# Altium project MMT.PrjPcb (part 1 of 2)
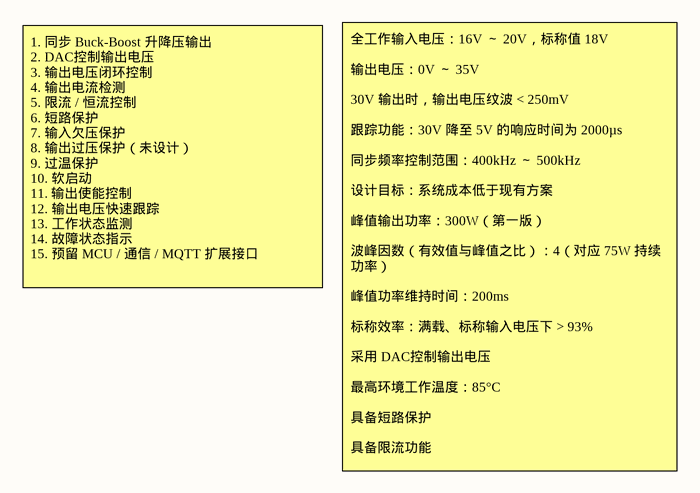
[diagram p0: main.SchDoc]
7 sheets, 325 parts. Net scope: global (net labels, ports and power ports of the same name join across sheets).
Board file: 数控电源.PcbDoc
Sheets:
  main.SchDoc
  SMPS_POWER.SchDoc
  Bias_Power_Supply.SchDoc
  CC_CV_Down-programmer.SchDoc
  CC_CV_Indicators_and_sense_error.SchDoc
  DAC、ADC、IO_Espander.SchDoc
  Bus isolators.SchDoc

## Sheet main.SchDoc
size A4; SheetNumber: 1; SheetTotal: 7

### Notes on the sheet
- 1. 同步 Buck-Boost 升降压输出
  2. DAC控制输出电压
  3. 输出电压闭环控制
  4. 输出电流检测
  5. 限流 / 恒流控制
  6. 短路保护
  7. 输入欠压保护
  8. 输出过压保护（未设计）
  9. 过温保护
  10. 软启动
  11. 输出使能控制
  12. 输出电压快速跟踪
  13. 工作状态监测
  14. 故障状态指示
  15. 预留 MCU / 通信 / MQTT 扩展接口
- 全工作输入电压：16V ～ 20V，标称值 18V
  输出电压：0V ～ 35V
  30V 输出时，输出电压纹波 < 250mV
  跟踪功能：30V 降至 5V 的响应时间为 2000µs
  同步频率控制范围：400kHz ～ 500kHz
  设计目标：系统成本低于现有方案
  峰值输出功率：300W（第一版）
  波峰因数（有效值与峰值之比）：4（对应 75W 持续功率）
  峰值功率维持时间：200ms
  标称效率：满载、标称输入电压下 > 93%
  采用 DAC控制输出电压
  最高环境工作温度：85°C
  具备短路保护
  具备限流功能

## Sheet SMPS_POWER.SchDoc
size A3; SheetNumber: 2; SheetTotal: 7
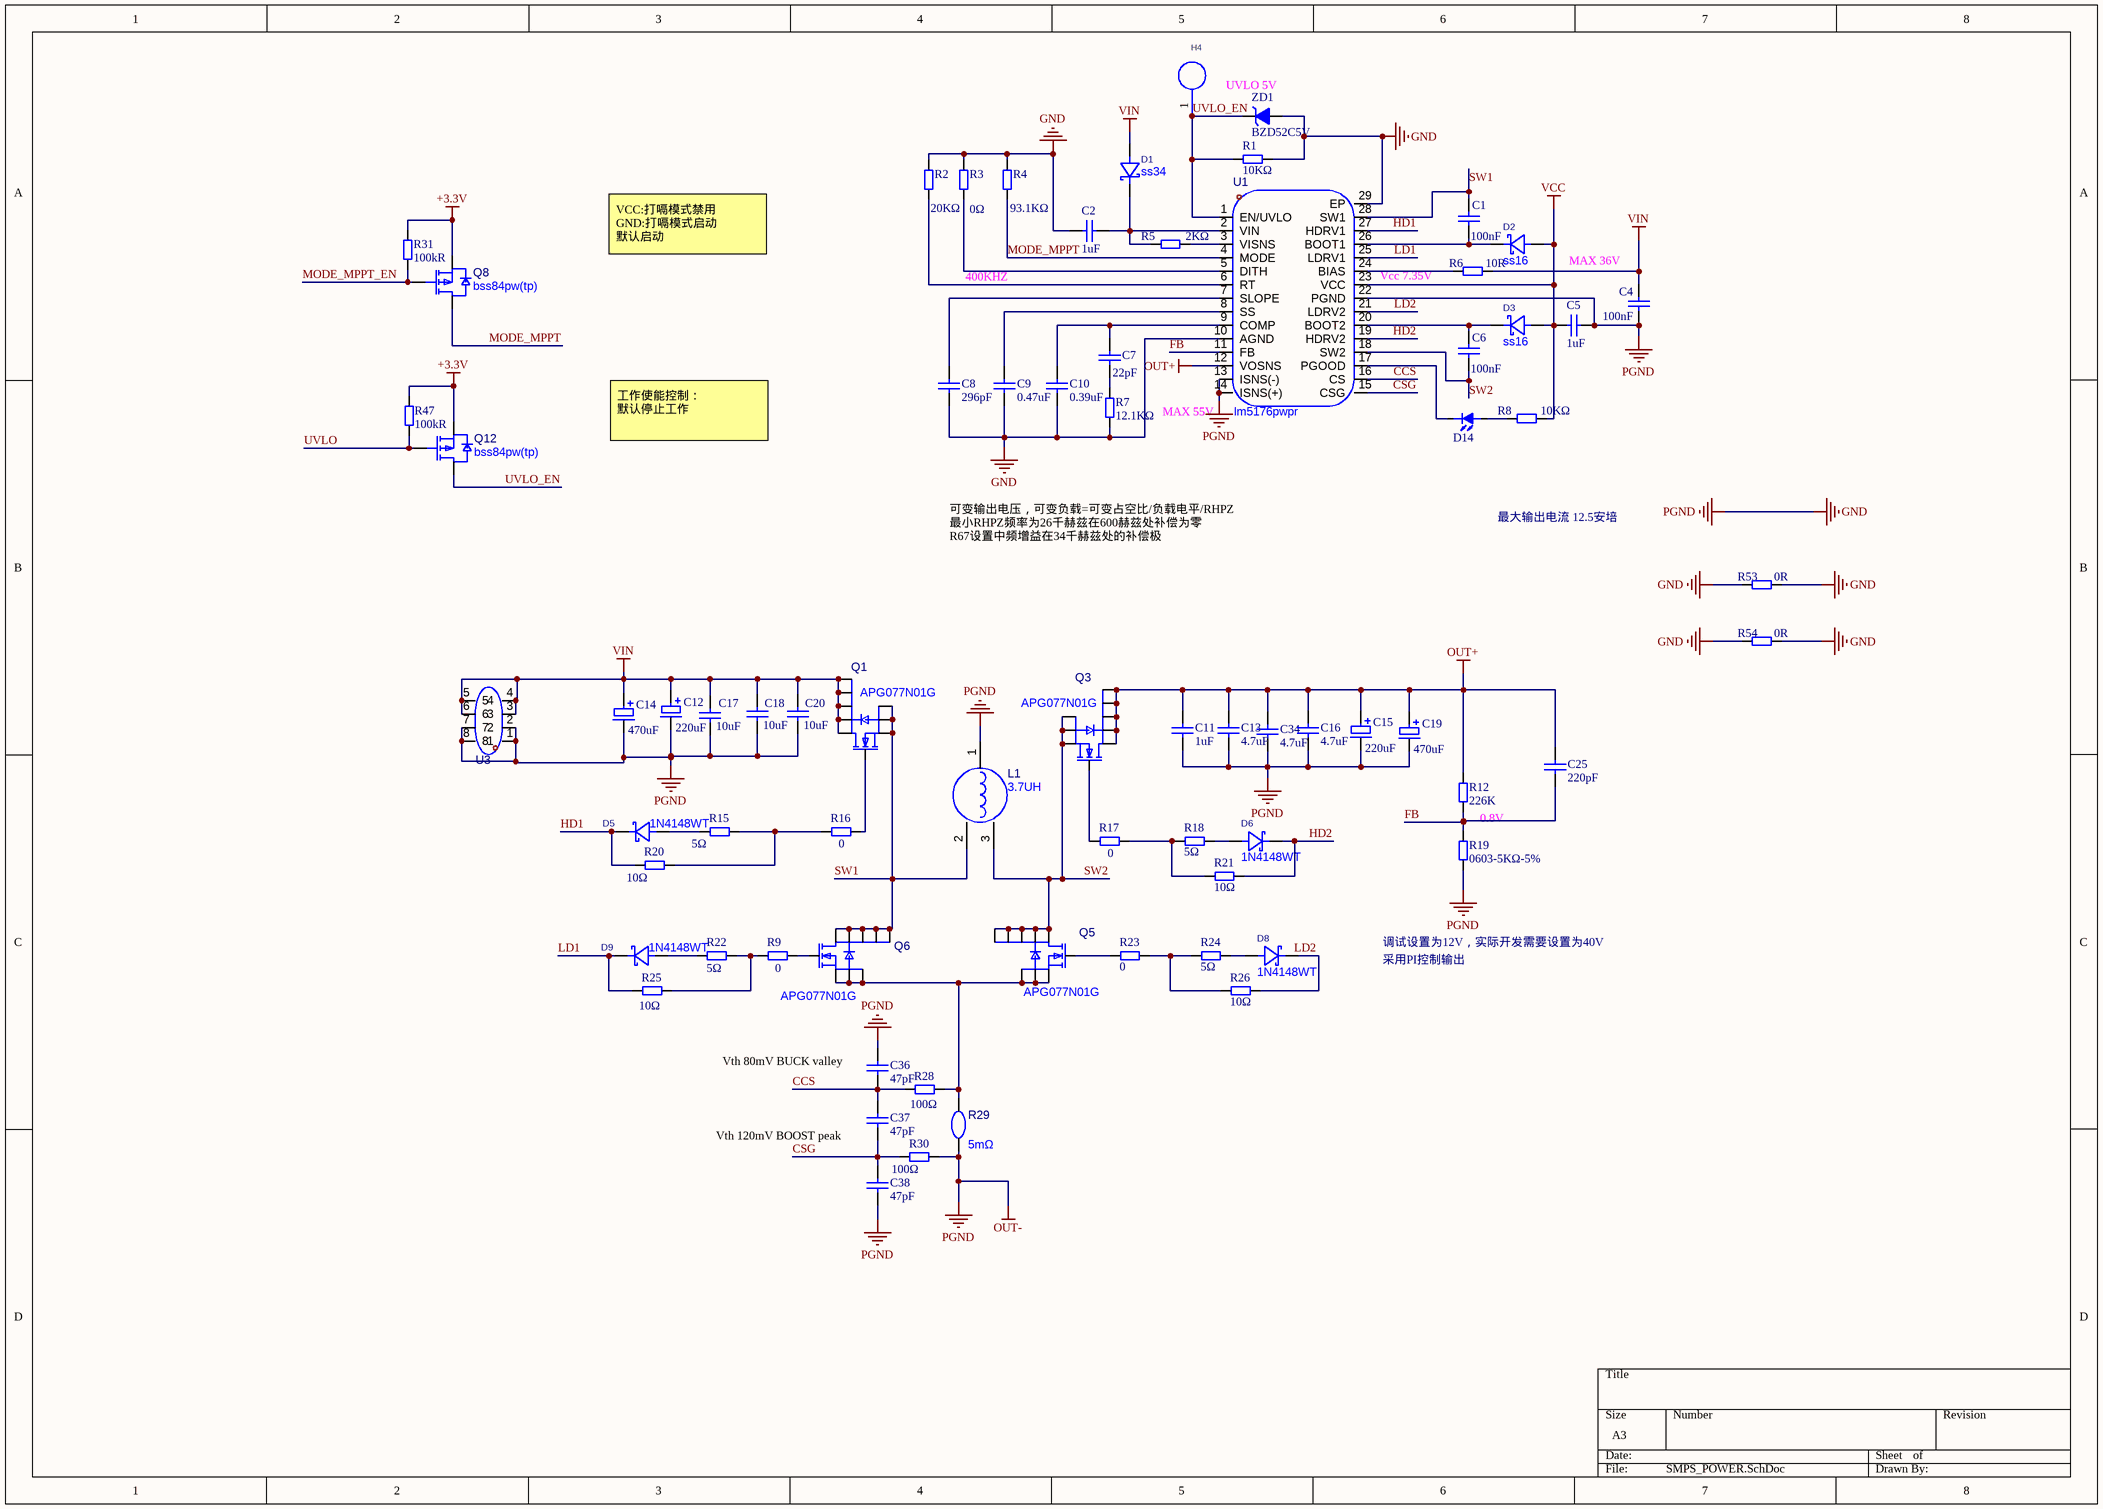
[diagram p1: SMPS_POWER.SchDoc]

### Parts
C1  100nF  [C0603]
C2  1uF  [C0603]
C4  100nF  [C0603]
C5  1uF  [C0603]
C6  100nF  [C0603]
C7  22pF  [C0603]
C8  296pF  [C0603]
C9  0.47uF  [C0603]
C10  0.39uF  [C0603]
C11  1uF  [C0805]
C12  220uF  [CAP-TH_BD8.0-P3.50-D0.5-FD]
C13  4.7uF  [C0805]
C14  470uF  [CAP-TH_BD8.0-P3.50-D0.5-FD]
C15  220uF  [CAP-TH_BD8.0-P3.50-D0.5-FD]
C16  4.7uF  [C0805]
C17  10uF  [C0805]
C18  10uF  [C0805]
C19  470uF  [CAP-TH_BD8.0-P3.50-D0.5-FD]
C20  10uF  [C0805]
C25  220pF  [C0603]
C34  4.7uF  [C0805]
C36  47pF  [C0603]
C37  47pF  [C0603]
C38  47pF  [C0603]
D1  ss34  [SMA_L4.3-W2.6-LS5.0-FD]
D2  ss16  [SMA_L4.3-W2.6-LS5.0-FD]
D3  ss16  [SMA_L4.3-W2.6-LS5.0-FD]
D5  1N4148WT  [SOD-523_L1.2-W0.8-LS1.6-FD]
D6  1N4148WT  [SOD-523_L1.2-W0.8-LS1.6-FD]
D8  1N4148WT  [SOD-523_L1.2-W0.8-LS1.6-FD]
D9  1N4148WT  [SOD-523_L1.2-W0.8-LS1.6-FD]
D14  DIO_LED  [LED0603-RD_RED]  (value not drawn)
H4  PZ254V-11-01P  [HDR-TH_1P-P2.54-V-M]  (value not drawn)
L1  3.7UH  [IND-SMD_3P-L15.5-W15.5-L]
Q1  APG077N01G  [PDFN-8_L5.8-W5.1-P1.27-LS6.1-BL]
Q3  APG077N01G  [PDFN-8_L5.8-W5.1-P1.27-LS6.1-BL]
Q5  APG077N01G  [PDFN-8_L5.8-W5.1-P1.27-LS6.1-BL]
Q6  APG077N01G  [PDFN-8_L5.8-W5.1-P1.27-LS6.1-BL]
Q8  bss84pw(tp)  [SOT-323-3_L2.0-W1.3-P1.30-LS2.1-BR]
Q12  bss84pw(tp)  [SOT-323-3_L2.0-W1.3-P1.30-LS2.1-BR]
R1  10KΩ  [R0603]
R2  20KΩ  [R0603]
R3  0Ω  [R0603]
R4  93.1KΩ  [R0603]
R5  2KΩ  [R0603]
R6  10R  [R0603]
R7  12.1KΩ  [R0603]
R8  10KΩ  [R0603]
R9  0  [R0603]
R12  226K  [R0603]
R15  5Ω  [R0603]
R16  0  [R0603]
R17  0  [R0603]
R18  5Ω  [R0603]
R19  0603-5KΩ-5%  [R0603]
R20  10Ω  [R0603]
R21  10Ω  [R0603]
R22  5Ω  [R0603]
R23  0  [R0603]
R24  5Ω  [R0603]
R25  10Ω  [R0603]
R26  10Ω  [R0603]
R28  100Ω  [R0603]
R29  5mΩ  [RES-SMD_L6.4-W3.2-1]
R30  100Ω  [R0603]
R31  100kR  [R0603]
R47  100kR  [R0603]
R53  0R  [R0603]
R54  0R  [R0603]
U1  lm5176pwpr  [HTSSOP-28_L9.7-W4.4-P0.65-LS6.4-BL-EP]
U3  c4201wr-2x4p_c5333418  [CONN-TH_8P-P4.20_CJT_C4201WR-2X4P]  (value not drawn)
ZD1  BZD52C5V  [SOD-123_L2.7-W1.6-LS3.7-RD]

### Nets
+3.3V: Q8.2(S) Q12.2(S) R31.1 R47.1
GND: C2.1 C4.1 C5.1 C8.1 C9.1 C10.1 C11.1 C12.2 C13.1 C14.2 C15.2 C16.1 C17.1 C18.1 C19.2 C20.1 C34.1 C36.2 C38.1 L1.1 R1.2 R2.2 R3.2 R4.2 R7.1 R19.1 R29.1 R30.1 R53.1 R53.2 R54.1 R54.2 U1.10(AGND) U1.13(ISNS(-)) U1.14(ISNS(+)) U1.22(PGND) U1.29(EP) U3.1 U3.2 U3.7 U3.8 ZD1.2  [also labelled OUT-, PGND]
OUT+: C11.2 C13.2 C15.1 C16.2 C19.1 C25.2 C34.2 Q3.5(D) Q3.6(D) Q3.7(D) Q3.8(D) Q3.9(D) R12.2 U1.12(VOSNS)  [project net SENSE+]
VCC: C5.2 D2.1(A) D3.1(A) R8.2 U1.23(VCC)
VIN: C4.2 C12.1 C14.1 C17.2 C18.2 C20.2 D1.1(A) Q1.5(D) Q1.6(D) Q1.7(D) Q1.8(D) Q1.9(D) R6.2 U3.3 U3.4 U3.5 U3.6
CCS: C36.1 C37.2 R28.2 U1.16(CS)
CSG: C37.1 C38.2 R30.2 U1.15(CSG)
FB: C25.1 R12.1 R19.2 U1.11(FB)
HD1: D5.2(K) R20.2 U1.27(HDRV1)
HD2: D6.2(K) R21.2 U1.19(HDRV2)
LD1: D9.2(K) R25.2 U1.25(LDRV1)
LD2: D8.2(K) R26.2 U1.21(LDRV2)
MODE_MPPT: Q8.3(D) R4.1 U1.4(MODE)
MODE_MPPT_EN: Q8.1(G) R31.2
SW1: C1.2 L1.2 Q1.1(S) Q1.2(S) Q1.3(S) Q6.5(D) Q6.6(D) Q6.7(D) Q6.8(D) Q6.9(D) U1.28(SW1)
SW2: C6.1 L1.3 Q3.1(S) Q3.2(S) Q3.3(S) Q5.5(D) Q5.6(D) Q5.7(D) Q5.8(D) Q5.9(D) U1.18(SW2)
UVLO: Q12.1(G) R47.2
UVLO_EN: H4.1 Q12.3(D) R1.1 U1.1(EN/UVLO) ZD1.1
NetC1_1: C1.1 D2.2(K) U1.26(BOOT1)
NetC2_2: C2.2 D1.2(K) R5.1 U1.2(VIN)
NetC6_2: C6.2 D3.2(K) U1.20(BOOT2)
NetC7_1: C7.1 R7.2
NetC7_2: C7.2 C10.2 U1.9(COMP)
NetC8_2: C8.2 U1.7(SLOPE)
NetC9_2: C9.2 U1.8(SS)
NetD5_1: D5.1(A) R15.2
NetD6_1: D6.1(A) R18.2
NetD8_1: D8.1(A) R24.2
NetD9_1: D9.1(A) R22.2
NetD14_1: D14.1 U1.17(PGOOD)
NetD14_2: D14.2 R8.1
NetQ1_4: Q1.4(G) R16.1
NetQ3_4: Q3.4(G) R17.2
NetQ5_1: Q5.1(S) Q5.2(S) Q5.3(S) Q6.1(S) Q6.2(S) Q6.3(S) R28.1 R29.2
NetQ5_4: Q5.4(G) R23.2
NetQ6_4: Q6.4(G) R9.1
NetR2_1: R2.1 U1.6(RT)
NetR3_1: R3.1 U1.5(DITH)
NetR5_2: R5.2 U1.3(VISNS)
NetR6_1: R6.1 U1.24(BIAS)
NetR9_2: R9.2 R22.1 R25.1
NetR15_1: R15.1 R16.2 R20.1
NetR17_1: R17.1 R18.1 R21.1
NetR23_1: R23.1 R24.1 R26.1

### Notes on the sheet
- UVLO 5V
- VCC:打嗝模式禁用
  GND:打嗝模式启动
  默认启动
- 400KHZ
- Vcc 7.35V
- MAX 36V
- 工作使能控制：
  默认停止工作
- (near U1) MAX 55V
- 最大输出电流 12.5安培
- 可变输出电压，可变负载=可变占空比/负载电平/RHPZ
  最小RHPZ频率为26千赫兹在600赫兹处补偿为零
  R67设置中频增益在34千赫兹处的补偿极
- 0.8V
- 调试设置为12V，实际开发需要设置为40V
- 采用PI控制输出
- (near C36) Vth 80mV BUCK valley
- Vth 120mV BOOST peak

### Library data of the parts
C1 C2 C4-C10 C25 C36-C38 = C0603: Capacitor; Value: 104; Published: 8-Jun-2000; LatestRevisionDate: 17-Jul-2002; LatestRevisionNote: Re-released for DXP Platform.; Publisher: Altium Limited
C11 C13 C16-C18 C20 C34 = C0805: Capacitor; Value: 104; Published: 8-Jun-2000; LatestRevisionDate: 17-Jul-2002; LatestRevisionNote: Re-released for DXP Platform.; Publisher: Altium Limited
C12 C14 C15 C19 = CAP_EC_1: 贴片铝电解电容（RVT1V101M0607）; Part Number: *; Brand: *
D1 = ss34_c7420365: 二极管配置:独立式;正向压降(Vf):550mV@3A;直流反向耐压(Vr):40V;整流电流:3A;; Manufacturer: R+O(宏嘉诚); AddInBom: yes; ModelId: 7e24bebe6cd74171ae8c9de6fc5b78aa; ModelTransform: 198.4248,103.5431,0,180,0,0,-0.001,0,0; Diode Configuration: 独立式; Voltage - DC Reverse(Vr): 40V; Current - Rectified: 3A; Reverse Leakage Current (Ir): 200uA@40V; Symbol: SS34_C7420365; LCSC Part Name: 电压:40V 电流:3A; SupplierPart: C7420365; ManufacturerPart: SS34; Supplier Footprint: SMA(DO-214AC); JLCPCB Part Class: Extended Part; Datasheet: https://item.szlcsc.com/datasheet/SS34/8397187.html; Supplier: LCSC; ConvertToPcb: yes; FootprintName: SMA_L4.3-W2.6-LS5.0-FD; ModelName: SMA_L4.3-W2.6-LS5.0-FD; Voltage - Forward(Vf@If): 550mV@3A
D2 D3 = ss34_c7420365: 二极管配置:独立式;正向压降(Vf):550mV@3A;直流反向耐压(Vr):40V;整流电流:3A;; Manufacturer: R+O(宏嘉诚); ManufacturerPart: SS34; AddInBom: yes; ModelId: 7e24bebe6cd74171ae8c9de6fc5b78aa; ModelTransform: 198.4248,103.5431,0,180,0,0,-0.001,0,0; Diode Configuration: 独立式; Voltage - DC Reverse(Vr): 40V; Current - Rectified: 3A; Reverse Leakage Current (Ir): 200uA@40V; Symbol: SS34_C7420365; LCSC Part Name: 电压:40V 电流:3A; SupplierPart: C7420365; Supplier Footprint: SMA(DO-214AC); JLCPCB Part Class: Extended Part; Datasheet: https://item.szlcsc.com/datasheet/SS34/8397187.html; Supplier: LCSC; ConvertToPcb: yes; FootprintName: SMA_L4.3-W2.6-LS5.0-FD; ModelName: SMA_L4.3-W2.6-LS5.0-FD; Voltage - Forward(Vf@If): 550mV@3A
D5 D6 D8 D9 = 1N4148WT: 二极管配置:独立式;整流电流:150mA;直流反向耐压(Vr):100V;正向压降(Vf):1.25V@150mA;反向恢复时间(Trr):4ns;; Manufacturer: R+O(宏嘉诚); Symbol: 1N4148WT_C7420320; AddInBom: yes; ModelId: 8f56a03db567494d8f4c9d12aa52a741; ModelName: SOD-523_L1.2-W0.8-H0.7-LS1.6; ModelTransform: 62.992,31.496,0,0,0,0,0,0,0; Diode Configuration: 独立式; Pd - Power Dissipation: 150mW; Current - Rectified: 150mA; Voltage - DC Reverse(Vr): 100V; Non-Repetitive Peak Forward Surge Current: 2A; Reverse Leakage Current (Ir): 1uA@75V; Reverse Recovery Time (trr): 4ns; Operating Junction Temperature Range: -55℃~+150℃; LCSC Part Name: 100V 150mA; SupplierPart: C7420320; ManufacturerPart: 1N4148WT; Supplier Footprint: SOD-523; JLCPCB Part Class: Extended Part; Datasheet: https://item.szlcsc.com/datasheet/1N4148WT/8397142.html; Supplier: LCSC; ConvertToPcb: yes; FootprintName: SOD-523_L1.2-W0.8-LS1.6-FD; Voltage - Forward(Vf@If): 1.25V@150mA
D14 = DIO_LED: Brand: LED; Part Number: *
H4 = PZ254V-11-01P: Manufacturer: XFCN(兴飞); Add into BOM: yes; Pin Structure: 1x1P; Pitch: 2.54mm; Circluar Pins/Square Pins: 方针; Symbol: PZ254V-11-01P; Device: PZ254V-11-01P; LCSC Part Name: 1x1P 间距:2.54mm 方针 直插; Supplier Part: C492400; Manufacturer Part: PZ254V-11-01P; Supplier Footprint: 插件,P=2.54mm; JLCPCB Part Class: Extended Part; Datasheet: https://atta.szlcsc.com/upload/public/pdf/source/20200309/C492400_46876A5B545F5AE6B8D4A09C46E276E8.pdf; Supplier: LCSC; Convert to PCB: yes; Row Spacing: -; Mounting Type: 直插; Number of Rows: 单排; Number of Pins: 1P; Current Rating: -; Voltage Rating (Max): -; Length of Mating Pin: 6mm; Insulation Height: 2.5mm; Length of End Connection Pin: 3mm; Contact Material: 黄铜; Contact Plating: -; Operating Temperature: -40℃~+105℃; Color: 黑色
L1 = cdep15d90t150np-4r7mc-125: 适用于高耐压(直流120V)和大电流。磁屏蔽。符合AEC Q200标准。工作温度范围:-40°C至+150°C(包括线圈自身温升); Manufacturer: Sumida(胜美达); AddInBom: yes; ModelId: 109db49b485b4137a89608c2501f93a1; ModelName: IND-SMD_3P-L15.5-W15.5-H10.0-L; ModelTransform: 611.022,610.235,0,180,0,0,0,0,0; Value: 4.7uH; Tolerance: ±20%; Rated Current: 16.5A; Saturation Current (Isat): 21.3A; DC Resistance (DCR): 3.5mΩ; Symbol: CDEP15D90T150NP-4R7MC-125; LCSC Part Name: 4.7uH ±20% 21.3A; SupplierPart: C171579; ManufacturerPart: CDEP15D90T150NP-4R7MC-125; Supplier Footprint: SMD-3P,15.5x15.5mm; JLCPCB Part Class: Extended Part; Datasheet: https://atta.szlcsc.com/upload/public/pdf/source/20180612/C171581_D70A455BA7744A0B5218E235967B6B52.pdf; Supplier: LCSC; ConvertToPcb: yes; FootprintName: IND-SMD_3P-L15.5-W15.5-L; Ratings: AEC-Q200
Q1 Q3 Q5 Q6 = apg077n01g: 数量:-;漏源电压(Vdss):100V;连续漏极电流(Id):90A;导通电阻(RDS(on)):7.7mΩ@10V;耗散功率(Pd):105W;阈值电压(Vgs(th)):3V@250uA;; Manufacturer: ALLPOWER(铨力); AddInBom: yes; ModelId: 178189b27e7544aca50c111426555358; ModelName: PDFN-8_L4.9-W5.8-H1.0-P1.27; ModelTransform: 200.787,240.157,0,0,0,0,0,0,0; Drain to Source Voltage: 100V; Current - Continuous Drain(Id): 90A; Pd - Power Dissipation: 105W; Gate Charge(Qg): 30nC@10V; Input Capacitance(Ciss): 3nF; Reverse Transfer Capacitance (Crss@Vds): 11pF; Type: N沟道; Output Capacitance(Coss): 362pF; Symbol: APG077N01G; LCSC Part Name: N沟道,电流:90A,耐压:100V; SupplierPart: C2840980; ManufacturerPart: APG077N01G; Supplier Footprint: PDFN-8(5x6); JLCPCB Part Class: Extended Part; Datasheet: https://item.szlcsc.com/datasheet/APG077N01G/3021876.html; Supplier: LCSC; ConvertToPcb: yes; FootprintName: PDFN-8_L5.8-W5.1-P1.27-LS6.1-BL; Number: -; RDS(on): 7.7mΩ@10V; Gate Threshold Voltage (Vgs(th)): 3V@250uA; Operating Temperature: -55℃~+150℃
Q8 Q12 = bss84pw(tp): 数量:1个P沟道;漏源电压(Vdss):50V;连续漏极电流(Id):-;导通电阻(RDS(on)):6Ω@5V;耗散功率(Pd):200mW;阈值电压(Vgs(th)):1.6V;; Manufacturer: TECH PUBLIC(台舟); AddInBom: yes; ModelId: 59529c0d6fc749f28f2d0659e12986b4; ModelName: SOT-323-3_L2.0-W1.3-H1.0-LS2.1-P1.30; ModelTransform: 78.74,82.677,0,90,0,0,0.0005,0,0; Number: 1个P沟道; Drain to Source Voltage: 50V; RDS(on): 6Ω@5V; Pd - Power Dissipation: 200mW; Gate Threshold Voltage (Vgs(th)): 1.6V; Input Capacitance(Ciss): 45pF; Reverse Transfer Capacitance (Crss@Vds): 12pF; Type: P沟道; Output Capacitance(Coss): 25pF; Vgs: ±20V; Symbol: BSS84PW(TP); LCSC Part Name: BSS84PW(TP); SupplierPart: C53340809; ManufacturerPart: BSS84PW(TP); Supplier Footprint: SOT-323; JLCPCB Part Class: Extended Part; Datasheet: https://item.szlcsc.com/datasheet/BSS84PW(TP)/56444021.html; Supplier: LCSC; ConvertToPcb: yes; FootprintName: SOT-323-3_L2.0-W1.3-P1.30-LS2.1-BR; Current - Continuous Drain(Id): -; Gate Charge(Qg): -; Operating Temperature: -55℃~+150℃; Configuration: -
R1-R9 R15-R18 R20-R26 R28 R30 R31 R47 R53 R54 = 0603-3KΩ-5%: 片式电阻; 物料描述: 片式电阻器-0805-10KΩ-5%-JT; 物料号: NA
R12 R19 = 0603-1KΩ-5%: 片式电阻; 物料描述: 片式电阻器-0805-10KΩ-5%-JT; 物料号: NA
R29 = hollr2512-3w-2mr-1%: 电阻类型:采样电阻;阻值:2mΩ;精度:±1%;额定压降:-;功率:3W;温度系数:±50ppm/℃;安装方式:贴片;; Manufacturer: Milliohm(毫欧); AddInBom: yes; ModelId: 2a92684014bd46c593e4aa7ce823c350; ModelTransform: 251.968,125.984,0,0,0,0,0,0,0; Value: 2mΩ; Tolerance: ±1%; Power(Watts): 3W; Rated Current: 77.5A; Mounting Sytle: 贴片; Symbol: HOLLR2512-3W-2MR-1%; LCSC Part Name: 2mΩ ±1% 3W; SupplierPart: C2994640; ManufacturerPart: HoLLR2512-3W-2mR-1%; Supplier Footprint: 2512; JLCPCB Part Class: Extended Part; Datasheet: https://atta.szlcsc.com/upload/public/pdf/source/20220330/9E8D3880B1628B3B70C68092C8A7E08B.pdf; Supplier: LCSC; ConvertToPcb: yes; FootprintName: RES-SMD_L6.4-W3.2-1; ModelName: RES-SMD_L6.4-W3.2-1; Type: 采样电阻; Rated Output Voltage: -; Temperature Coefficient: ±50ppm/℃
U1 = lm5176pwpr: 功能类型:升降压型;工作电压:4.2V~55V;输出电压:800mV~55V;输出电流:2A;输出类型:可调;; Manufacturer: TI(德州仪器); AddInBom: yes; ModelId: c33b2f64442f42ecb27b91aed85c9e5a; ModelTransform: 381.889,251.968,0,0,0,0,0,0,0; Function: 升降压型; Output Current: 2A; Frequency - Switching: 600kHz; Synchronous Rectifier: 是; Number of Outputs: 1; Topology: 降压式；升压式; Quiescent Current: 2mA; Switch tube (built-in/external): 外置; Output Type: 可调; Symbol: LM5176PWPR; LCSC Part Name: 升降压型 4.2V~55V; SupplierPart: C442493; ManufacturerPart: LM5176PWPR; Supplier Footprint: HTSSOP-28-EP; JLCPCB Part Class: Extended Part; Datasheet: https://www.ti.com/cn/lit/gpn/lm5176; Supplier: LCSC; ConvertToPcb: yes; FootprintName: HTSSOP-28_L9.7-W4.4-P0.65-LS6.4-BL-EP; ModelName: HTSSOP-28_L9.7-W4.4-P0.65-LS6.4-BL-EP; Voltage - Supply: 4.2V~55V; Output Voltage: 800mV~55V; Operating Temperature: -40℃~+125℃@(TJ); Features: 频率同步；逐波限流；可调软启动；过流保护；EMI优化(抖频模式)；打嗝限流
U3 = c4201wr-2x4p_c5333418: 插针结构:2x4P;间距:4.2mm;安装方式:弯插;总PIN数:8P;排数:2;每排PIN数:4;额定电流:13A;触头材质:黄铜;触头镀层:锡;工作温度:-40℃~+105℃;; Manufacturer: CJT(长江连接器); AddInBom: yes; ModelId: 4d4809cc7aa74aa0a0d297a6ab6683bc; ModelTransform: 709.0537,785.4315,0,0,0,0,-0.002,-261.811,-137.795; Pins Structure: 2x4P; Pitch: 4.2mm; Number of PINs Per Row: 4; Current Rating: 13A; Voltage Rating: 600V; Plastic Material: PA66; Flame Retardant Rating: UL94V-2; Z-Height of the Board: 9.6mm; Symbol: C4201WR-2X4P_C5333418; LCSC Part Name: 2x4P 间距:4.2mm 弯插; SupplierPart: C5333418; ManufacturerPart: C4201WR-2x4P; Supplier Footprint: 弯插,P=4.2mm; JLCPCB Part Class: Extended Part; Datasheet: https://item.szlcsc.com/datasheet/C4201WR-2x4P/6094518.html; Supplier: LCSC; ConvertToPcb: yes; FootprintName: CONN-TH_8P-P4.20_CJT_C4201WR-2X4P; ModelName: CONN-TH_8P-P4.20_CJT_C4201WR-2X4P; Mounting Type: 弯插; Number of Pins: 8P; Number of Rows: 2; Contact Material: 黄铜; Contact Plating: 锡; Operating Temperature: -40℃~+105℃; Color: 透明色
ZD1 = DIO_ZENER_3: 20V稳压管; Brand: 10V; Part Number: *

## Sheet Bias_Power_Supply.SchDoc
size A4; SheetNumber: 3; SheetTotal: 7
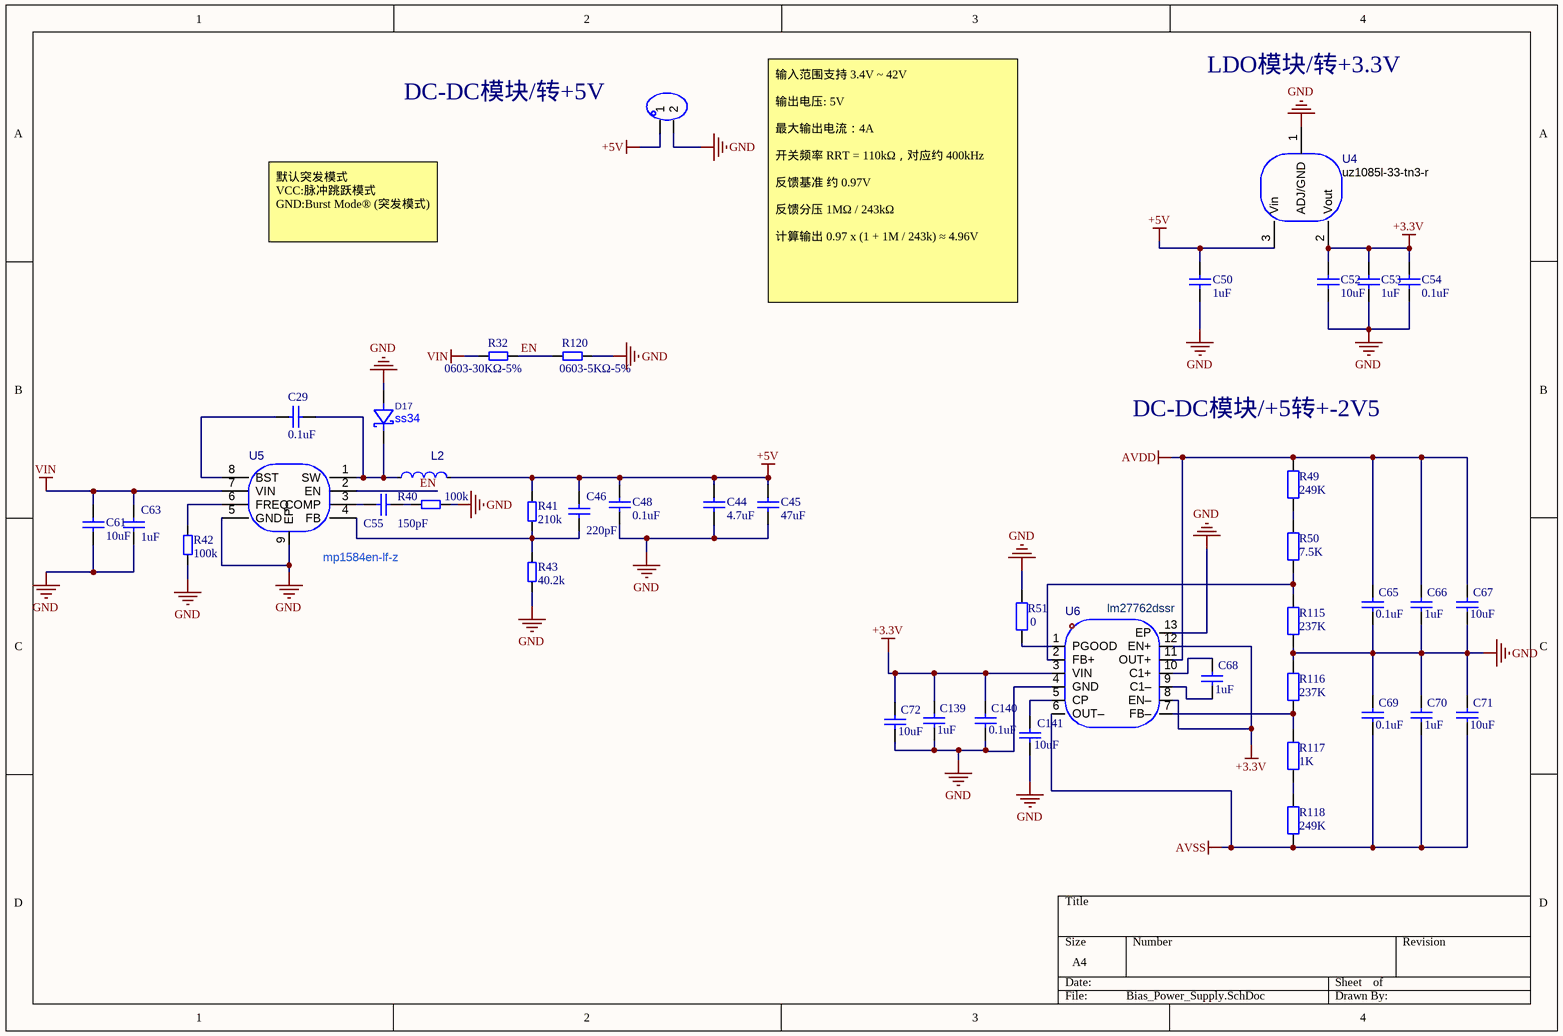
[diagram p2: Bias_Power_Supply.SchDoc]

### Parts
C29  0.1uF  [C0603]
C44  4.7uF  [C0805]
C45  47uF  [C0805]
C46  220pF  [C0603]
C48  0.1uF  [C0603]
C50  1uF  [C0603]
C52  10uF  [C0603]
C53  1uF  [C0603]
C54  0.1uF  [C0603]
C55  150pF  [C0603]
C61  10uF  [C0805]
C63  1uF  [C0603]
C65  0.1uF  [C0603]
C66  1uF  [C0603]
C67  10uF  [C0603]
C68  1uF  [C0603]
C69  0.1uF  [C0603]
C70  1uF  [C0603]
C71  10uF  [C0603]
C72  10uF  [C0603]
C139  1uF  [C0603]
C140  0.1uF  [C0603]
C141  10uF  [C0603]
D17  ss34  [SMA_L4.3-W2.6-LS5.0-FD]
H7  pz254v-11-02p  [HDR-TH_2P-P2.54-V-M]  (value not drawn)
L2  fxl0630-100-m  [IND-SMD_L7.3-W6.8]  (value not drawn)
R32  0603-30KΩ-5%  [R0603]
R40  100k  [R0603]
R41  210k  [R0603]
R42  100k  [R0603]
R43  40.2k  [R0603]
R49  249K  [R0603]
R50  7.5K  [R0603]
R51  0  [R0603]
R115  237K  [R0603]
R116  237K  [R0603]
R117  1K  [R0603]
R118  249K  [R0603]
R120  0603-5KΩ-5%  [R0603]
U4  uz1085l-33-tn3-r  [TO-252-2_L6.6-W6.1-P4.58-TL]
U5  mp1584en-lf-z  [SOIC-8_L5.0-W4.0-P1.27-LS6.0-BL-EP2.0]
U6  lm27762dssr  [WSON-12_L3.0-W2.0-P0.50-BL-EP]

### Nets
+3.3V: C52.2 C53.2 C54.2 C72.2 C139.2 C140.2 U4.2(Vout) U6.3(VIN) U6.8(EN–) U6.12(EN+)
+5V: C44.2 C45.2 C46.1 C48.2 C50.2 H7.1 L2.2 R41.1 U4.3(Vin)
AVDD: C65.2 C66.2 C67.2 R49.2 U6.11(OUT+)
AVSS: C69.1 C70.1 C71.1 R118.1 U6.6(OUT–)
GND: C44.1 C45.1 C48.1 C50.1 C52.1 C53.1 C54.1 C61.1 C63.1 C65.1 C66.1 C67.1 C69.2 C70.2 C71.2 C72.1 C139.1 C140.1 C141.1 D17.1(A) H7.2 R40.2 R42.1 R43.2 R51.2 R115.1 R116.2 R120.2 U4.1(ADJ/GND) U5.5(GND) U5.9(EP) U6.4(GND) U6.13(EP)
VIN: C61.2 C63.2 R32.1 U5.7(VIN)
EN: R32.2 R120.1 U5.2(EN)
NetC29_1: C29.1 D17.2(K) L2.1 U5.1(SW)
NetC29_2: C29.2 U5.8(BST)
NetC46_2: C46.2 R41.2 R43.1 U5.4(FB)
NetC55_1: C55.1 R40.1
NetC55_2: C55.2 U5.3(COMP)
NetC68_1: C68.1 U6.9(C1–)
NetC68_2: C68.2 U6.10(C1+)
NetC141_2: C141.2 U6.5(CP)
NetR42_2: R42.2 U5.6(FREQ)
NetR49_1: R49.1 R50.2
NetR50_1: R50.1 R115.2 U6.2(FB+)
NetR51_1: R51.1 U6.1(PGOOD)
NetR116_1: R116.1 R117.2 U6.7(FB–)
NetR117_1: R117.1 R118.2

### Notes on the sheet
- DC-DC模块/转+5V
- LDO模块/转+3.3V
- 默认突发模式
  VCC:脉冲跳跃模式
  GND:Burst Mode® (突发模式)
- 输入范围支持 3.4V ~ 42V
  输出电压: 5V
  最大输出电流：4A
  开关频率	RRT = 110kΩ，对应约 400kHz
  反馈基准	约 0.97V
  反馈分压	1MΩ / 243kΩ
  计算输出	0.97 x (1 + 1M / 243k) ≈ 4.96V
- (near R49) DC-DC模块/+5转+-2V5

### Library data of the parts
C29 C46 C48 C50 C52-C55 C63 = C0603: Capacitor; Value: 104; Published: 8-Jun-2000; LatestRevisionDate: 17-Jul-2002; LatestRevisionNote: Re-released for DXP Platform.; Publisher: Altium Limited
C44 C45 C61 = C0805: Capacitor; Value: 104; Published: 8-Jun-2000; LatestRevisionDate: 17-Jul-2002; LatestRevisionNote: Re-released for DXP Platform.; Publisher: Altium Limited
C65 C69 C140 = C0603: CAP CER 0.1UF 25V, 10% X7R 0603; Value: 104; Published: 8-Jun-2000; LatestRevisionDate: 17-Jul-2002; LatestRevisionNote: Re-released for DXP Platform.; Publisher: Altium Limited
C66 C68 C70 C139 = C0603: CAP CER 1UF 25V, 10% X7R 0603; Value: 104; Published: 8-Jun-2000; LatestRevisionDate: 17-Jul-2002; LatestRevisionNote: Re-released for DXP Platform.; Publisher: Altium Limited
C67 C71 C72 C141 = C0603: CAP CER 10UF 25V, 10% X7R 0603; Value: 104; Published: 8-Jun-2000; LatestRevisionDate: 17-Jul-2002; LatestRevisionNote: Re-released for DXP Platform.; Publisher: Altium Limited
D17 = ss34_c7420365: as D1 on sheet SMPS_POWER; Symbol: SS34_C7420365; LCSC Part Name: 电压:40V 电流:3A; SupplierPart: C7420365; ManufacturerPart: SS34; Supplier Footprint: SMA(DO-214AC); JLCPCB Part Class: Extended Part; Datasheet: https://item.szlcsc.com/datasheet/SS34/8397187.html; Supplier: LCSC; ConvertToPcb: yes; FootprintName: SMA_L4.3-W2.6-LS5.0-FD; ModelName: SMA_L4.3-W2.6-LS5.0-FD; Voltage - Forward(Vf@If): 550mV@3A
H7 = pz254v-11-02p: 插针结构:1x2P;间距:2.54mm;行距:-;圆针/方针:方针;安装方式:直插;排数:单排;总PIN位数:2P;额定电流:3A;额定电压:250V;配合针长度:6mm;塑高:2.5mm;端接针长度:3mm;触头材质:黄铜;触头镀层:-;工作温度:-40℃~+105℃;颜色:黑色;; Manufacturer: XFCN(兴飞); AddInBom: yes; ModelId: e35305ec3aa84b66b849f914b715e73f; ModelName: HDR2.54-M-LI-1X2P; ModelTransform: 200,100,0,0,0,0,0,0,-118.11; Pin Structure: 1x2P; Pitch: 2.54mm; Circluar Pins/Square Pins: 方针; Current Rating: 3A; Voltage Rating (Max): 250V; Symbol: PZ254V-11-02P; LCSC Part Name: 1x2P 间距:2.54mm 方针 直插; SupplierPart: C492401; ManufacturerPart: PZ254V-11-02P; Supplier Footprint: 插件,P=2.54mm; JLCPCB Part Class: Extended Part; Datasheet: https://item.szlcsc.com/datasheet/PZ254V-11-02P/502957.html; Supplier: LCSC; ConvertToPcb: yes; FootprintName: HDR-TH_2P-P2.54-V-M; Row Spacing: -; Mounting Type: 直插; Number of Rows: 单排; Number of Pins: 2P; Length of Mating Pin: 6mm; Insulation Height: 2.5mm; Length of End Connection Pin: 3mm; Contact Material: 黄铜; Contact Plating: -; Operating Temperature: -40℃~+105℃; Color: 黑色
L2 = fxl0630-100-m: 电感值:10uH;精度:±20%;额定电流:4.5A;饱和电流(Isat):5.5A;类型:一体成型电感;; Manufacturer: cjiang(长江微电); AddInBom: yes; ModelId: e28854526ca747668ea12fbe1dd39a63; ModelName: IND-SMD_L7.3-W6.8-H3.0; ModelTransform: 292.125,267.716,0,0,0,0,0,0,0; Value: 10uH; Tolerance: ±20%; Current Rating: 4.5A; Current - Saturation(Isat): 5.5A; DC Resistance(DCR): 68mΩ; Type: 一体成型电感; Symbol: FXL0630-100-M; LCSC Part Name: 10uH ±20% 5.5A; SupplierPart: C167223; ManufacturerPart: FXL0630-100-M; Supplier Footprint: SMD,7x6.6mm; JLCPCB Part Class: Extended Part; Datasheet: https://item.szlcsc.com/datasheet/FXL0630-100-M/178606.html; Supplier: LCSC; ConvertToPcb: yes; FootprintName: IND-SMD_L7.3-W6.8; Ratings: -
R32 R120 = 0603-1KΩ-5%: as R12 on sheet SMPS_POWER
R40-R43 = 0603-3KΩ-5%: as R1 on sheet SMPS_POWER
R49 R118 = R0603: 薄膜电阻 249kΩ ±0.1% 100mW; Published: 8-Jun-2000; LatestRevisionDate: 17-Jul-2002; LatestRevisionNote: Re-released for DXP Platform.; Publisher: Altium Limited
R50 R51 R115 R116 = R0603: Resistor; Published: 8-Jun-2000; LatestRevisionDate: 17-Jul-2002; LatestRevisionNote: Re-released for DXP Platform.; Publisher: Altium Limited
R117 = R0603: 厚膜电阻 1kΩ ±1% 100mW; Published: 8-Jun-2000; LatestRevisionDate: 17-Jul-2002; LatestRevisionNote: Re-released for DXP Platform.; Publisher: Altium Limited
U4 = uz1085l-33-tn3-r: 输出极性:正极;工作电压:18V;输出电压:3.3V;输出电流:3A;电源纹波抑制比(PSRR):72dB@(120Hz);输出类型:固定;; Manufacturer: UTC(友顺); AddInBom: yes; ModelId: ce57f84d66384067af8a68020b6de06d; ModelName: TO-252-2L-3P_L6.6-W6.1-H2.3-LS10.1-P4.6; ModelTransform: 259.842,390.52442,0,270,0,0,31.494,-0.12,0; Output Configuration: 正极; Voltage - Supply: 18V; Output Voltage: 3.3V; Output Current: 3A; Voltage Dropout: 1.4V@(3A); standby current: 4mA; Noise: 0.003%Vout; Output Type: 固定; Number of Outputs: 1; Symbol: UZ1085L-33-TN3-R; LCSC Part Name: 3.3V 3A 18V; SupplierPart: C125622; ManufacturerPart: UZ1085L-33-TN3-R; Supplier Footprint: TO-252-2(DPAK); JLCPCB Part Class: Extended Part; Datasheet: https://item.szlcsc.com/datasheet/UZ1085L-33-TN3-R/136900.html; Supplier: LCSC; ConvertToPcb: yes; FootprintName: TO-252-2_L6.6-W6.1-P4.58-TL; Power Supply Rejection Ratio (PSRR): 72dB@(120Hz); Features: 过流保护；热关断; Operating Temperature: -40℃~+85℃
U5 = mp1584en-lf-z: 功能类型:降压型;工作电压:4.5V~28V;输出电压:800mV~25V;输出电流:3A;输出类型:可调;; Manufacturer: MPS(芯源); AddInBom: yes; ModelId: d3dfb165ce8644e793b750cd6f375e75; ModelTransform: 192.913,236.22,0,0,0,0,0,0,0; Function: 降压型; Output Current: 3A; Frequency - Switching: 100kHz~1.5MHz; Synchronous Rectifier: 否; Number of Outputs: 1; Topology: 降压式; Quiescent Current: 100uA; Switch tube (built-in/external): 内置; Output Type: 可调; Symbol: MP1584EN-LF-Z; LCSC Part Name: 降压型 3A 4.5V~28V; SupplierPart: C15051; ManufacturerPart: MP1584EN-LF-Z; Supplier Footprint: SOIC-8-EP; JLCPCB Part Class: Extended Part; Datasheet: https://item.szlcsc.com/datasheet/MP1584EN-LF-Z/15724.html; Supplier: LCSC; ConvertToPcb: yes; FootprintName: SOIC-8_L5.0-W4.0-P1.27-LS6.0-BL-EP2.0; ModelName: SOIC-8_L5.0-W4.0-P1.27-LS6.0-BL-EP2.0; Voltage - Supply: 4.5V~28V; Output Voltage: 800mV~25V; Operating Temperature: -20℃~+85℃@(TA); Features: 轻载高效模式；外部补偿；过流保护
U6 = lm27762dssr: LM27762 带有集成 LDO 的低噪声正负输出电荷泵; Manufacturer: TI(德州仪器); AddInBom: yes; ModelId: 75df7d26feb145b0ac5ce3287ea6d356; ModelName: WSON-12_L3.0-W2.0-H0.8-P0.50; ModelTransform: 79.527,118.8974,0,90,0,0,0,0,0; Function: 反相; Operating Voltage: 2.7V~5.5V; Output Voltage: -5V~-1.5V；1.5V~5V; Output Current: 250mA; Quiescent Current: 390uA; Output Resistance: 2.5Ω; Switching Frequency: 2MHz; PFM Mode: 支持; Symbol: LM27762DSSR; LCSC Part Name: 低噪声正负输出集成电荷泵加LDO; SupplierPart: C473398; ManufacturerPart: LM27762DSSR; Supplier Footprint: WSON-12-EP(2x3); JLCPCB Part Class: Extended Part; Datasheet: https://www.ti.com/cn/lit/ds/symlink/lm27762.pdf; Supplier: LCSC; ConvertToPcb: yes; FootprintName: WSON-12_L3.0-W2.0-P0.50-BL-EP; Energy Efficiency: -; Operating Temperature: -40℃~+85℃; Features: 自适应开关频率；过流保护；低纹波/低噪声架构；输出短路保护；低功耗待机

## Sheet CC_CV_Down-programmer.SchDoc
size A3; SheetNumber: 4; SheetTotal: 7
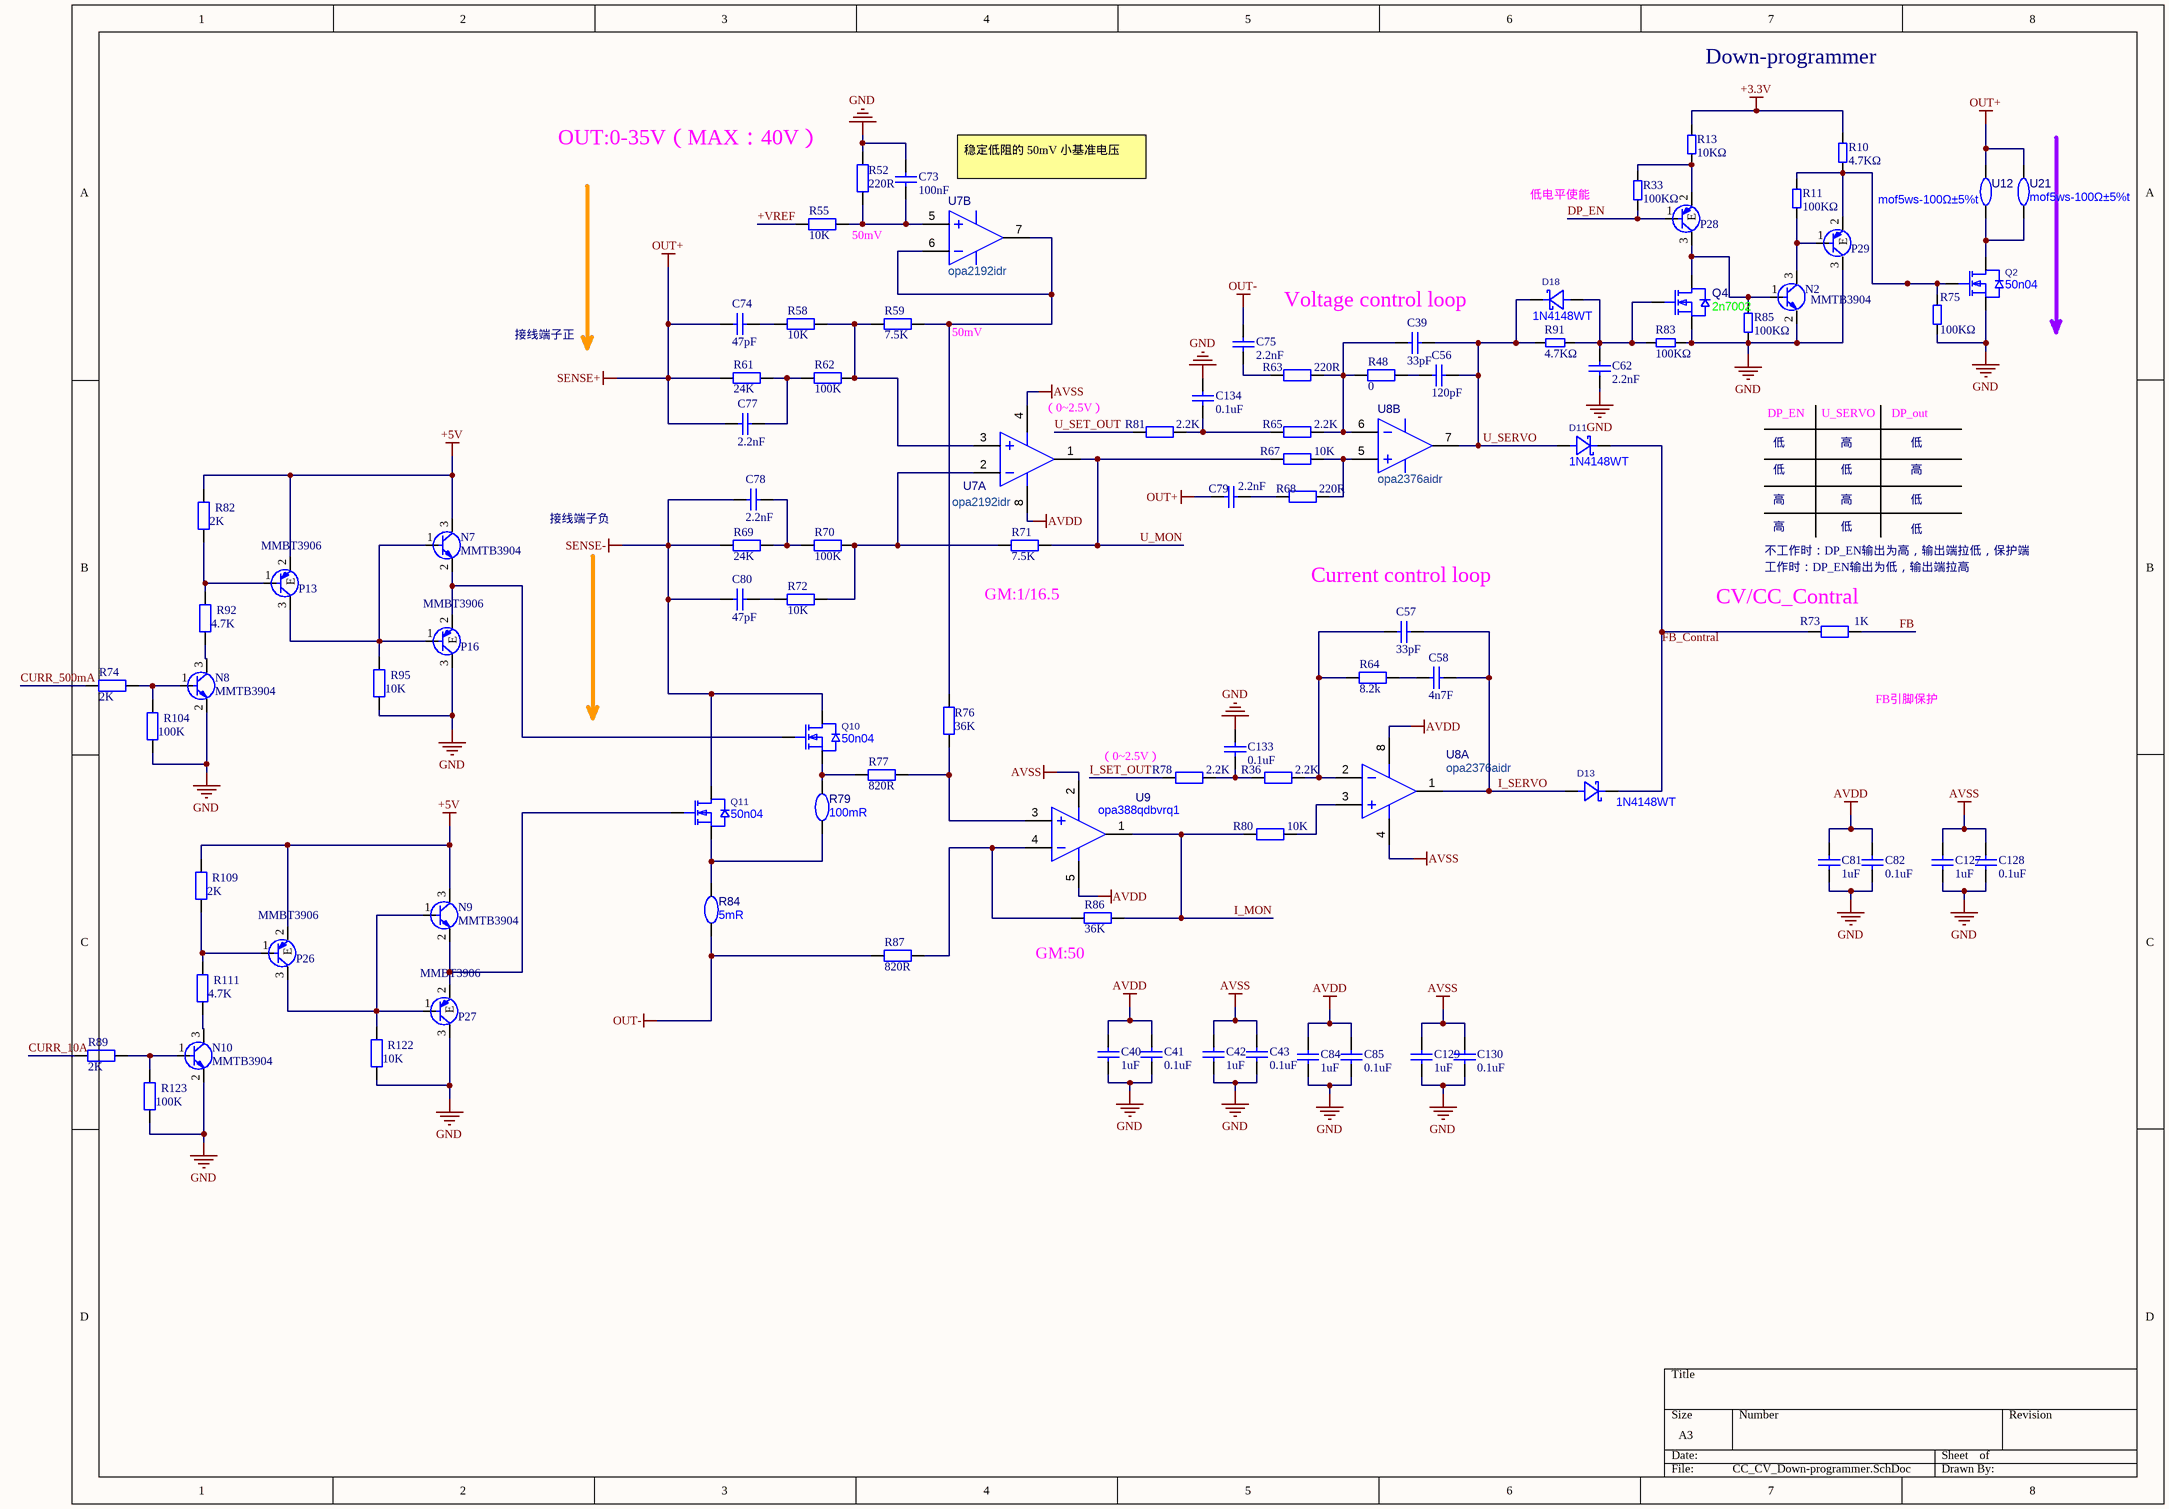
[diagram p3: CC_CV_Down-programmer.SchDoc]

### Parts
C39  33pF  [C0603]
C40  1uF  [C0603]
C41  0.1uF  [C0603]
C42  1uF  [C0603]
C43  0.1uF  [C0603]
C56  120pF  [C0603]
C57  33pF  [C0603]
C58  4n7F  [C0603]
C62  2.2nF  [C0603]
C73  100nF  [C0603]
C74  47pF  [C0603]
C75  2.2nF  [C0603]
C77  2.2nF  [C0603]
C78  2.2nF  [C0603]
C79  2.2nF  [C0603]
C80  47pF  [C0603]
C81  1uF  [C0603]
C82  0.1uF  [C0603]
C84  1uF  [C0603]
C85  0.1uF  [C0603]
C127  1uF  [C0603]
C128  0.1uF  [C0603]
C129  1uF  [C0603]
C130  0.1uF  [C0603]
C133  0.1uF  [C0603]
C134  0.1uF  [C0603]
D11  1N4148WT  [SOD-523_L1.2-W0.8-LS1.6-FD]
D13  1N4148WT  [SOD-523_L1.2-W0.8-LS1.6-FD]
D18  1N4148WT  [SOD-523_L1.2-W0.8-LS1.6-FD]
N2  MMTB3904  [SOT-23-3_L2.9-W1.3-P1.90-LS2.4-BR - duplicate]
N7  MMTB3904  [SOT-23-3_L2.9-W1.3-P1.90-LS2.4-BR - duplicate]
N8  MMTB3904  [SOT-23-3_L2.9-W1.3-P1.90-LS2.4-BR - duplicate]
N9  MMTB3904  [SOT-23-3_L2.9-W1.3-P1.90-LS2.4-BR - duplicate]
N10  MMTB3904  [SOT-23-3_L2.9-W1.3-P1.90-LS2.4-BR - duplicate]
P13  MMBT3906  [SOT-23-3_L2.9-W1.3-P1.90-LS2.4-BR]
P16  MMBT3906  [SOT-23-3_L2.9-W1.3-P1.90-LS2.4-BR]
P26  MMBT3906  [SOT-23-3_L2.9-W1.3-P1.90-LS2.4-BR]
P27  MMBT3906  [SOT-23-3_L2.9-W1.3-P1.90-LS2.4-BR]
P28  MMBT3906  [SOT-23-3_L2.9-W1.3-P1.90-LS2.4-BR]  (value not drawn)
P29  MMBT3906  [SOT-23-3_L2.9-W1.3-P1.90-LS2.4-BR]  (value not drawn)
Q2  50n04  [TO-252-2_L6.6-W6.1-P4.57-LS9.9-BR-CW]
Q4  2n7002  [SOT-23-3_L2.9-W1.3-P1.90-LS2.4-BR]
Q10  50n04  [TO-252-2_L6.6-W6.1-P4.57-LS9.9-BR-CW]
Q11  50n04  [TO-252-2_L6.6-W6.1-P4.57-LS9.9-BR-CW]
R10  4.7KΩ  [R0603]
R11  100KΩ  [R0603]
R13  10KΩ  [R0603]
R33  100KΩ  [R0603]
R36  2.2K  [R0603]
R48  0  [R0603]
R52  220R  [R0603]
R55  10K  [R0603]
R58  10K  [R0603]
R59  7.5K  [R0603]
R61  24K  [R0603]
R62  100K  [R0603]
R63  220R  [R0603]
R64  8.2k  [R0603]
R65  2.2K  [R0603]
R67  10K  [R0603]
R68  220R  [R0603]
R69  24K  [R0603]
R70  100K  [R0603]
R71  7.5K  [R0603]
R72  10K  [R0603]
R73  1K  [R0603]
R74  2K  [R0603]
R75  100KΩ  [R0603]
R76  36K  [R0603]
R77  820R  [R0603]
R78  2.2K  [R0603]
R79  100mR  [RES-SMD_L6.4-W3.2-1]
R80  10K  [R0603]
R81  2.2K  [R0603]
R82  2K  [R0603]
R83  100KΩ  [R0603]
R84  5mR  [RES-SMD_L6.4-W3.2-1]
R85  100KΩ  [R0603]
R86  36K  [R0603]
R87  820R  [R0603]
R89  2K  [R0603]
R91  4.7KΩ  [R0603]
R92  4.7K  [R0603]
R95  10K  [R0603]
R104  100K  [R0603]
R109  2K  [R0603]
R111  4.7K  [R0603]
R122  10K  [R0603]
R123  100K  [R0603]
U7  opa2192idr  [SOIC-8_L4.9-W3.9-P1.27-LS6.0-BL]  (parts A,B of 2)
U8  opa2376aidr  [SOIC-8_L4.9-W3.9-P1.27-LS6.0-BL]  (parts A,B of 2)
U9  opa388qdbvrq1  [SOT-23-5_L3.0-W1.7-P0.95-LS2.8-BR]
U12  mof5ws-100Ω±5%t  [RES-TH_BD6.0-L17.5-P21.50-D0.7]
U21  mof5ws-100Ω±5%t  [RES-TH_BD6.0-L17.5-P21.50-D0.7]

### Nets
+3.3V: R10.2 R13.2
+5V: N7.3 N9.3 P13.2(E) P26.2(E) R82.1 R109.1
+VREF: R55.2
AVDD: C40.2 C41.2 C81.2 C82.2 C84.2 C85.2 U7.8(VDD) U8.8(V+) U9.5(V+)
AVSS: C42.2 C43.2 C127.2 C128.2 C129.2 C130.2 U7.4(VSS) U8.4(V-) U9.2(V-)
GND: C40.1 C41.1 C42.1 C43.1 C62.2 C73.2 C75.1 C81.1 C82.1 C84.1 C85.1 C127.1 C128.1 C129.1 C130.1 C133.2 C134.2 N2.2 N8.2 N10.2 P16.3(C) P27.3(C) P29.3(C) Q2.3(S) Q4.2(S) R52.1 R75.1 R83.2 R84.1 R85.1 R87.2 R95.2 R104.2 R122.2 R123.2  [also labelled OUT-]
SENSE+: C74.1 C77.1 C79.1 R61.2 U12.2 U21.2  [also labelled OUT+]
SENSE-: C78.1 C80.1 Q10.2(D) Q11.2(D) R69.2
CURR_10A: R89.1
CURR_500mA: R74.1
DP_EN: P28.1(B) R33.1
FB: R73.1
FB_Contral: D11.2(K) D13.2(K) R73.2
I_MON: R80.2 R86.2 U9.1(OUTA)
I_SERVO: C57.2 C58.2 D13.1(A) U8.1(OUT_A)
I_SET_OUT: R78.2
U_MON: R67.2 R71.1 U7.1(VOUTA)
U_SERVO: C39.2 C56.2 D11.1(A) D18.2(K) R91.1 U8.7(OUT_B)
U_SET_OUT: R81.2
NetC39_1: C39.1 R48.2 R63.1 R65.1 U8.6(IN_B-)
NetC56_1: C56.1 R48.1
NetC57_1: C57.1 R36.1 R64.2 U8.2(IN_A-)
NetC58_1: C58.1 R64.1
NetC62_1: C62.1 D18.1(A) Q4.1(G) R83.1 R91.2
NetC73_1: C73.1 R52.2 R55.1 U7.5(VINB+)
NetC74_2: C74.2 R58.2
NetC75_2: C75.2 R63.2
NetC77_2: C77.2 R61.1 R62.2
NetC78_2: C78.2 R69.1 R70.2
NetC79_2: C79.2 R68.2
NetC80_2: C80.2 R72.2
NetC133_1: C133.1 R36.2 R78.1
NetC134_1: C134.1 R65.2 R81.1
NetN2_1: N2.1 P28.3(C) Q4.3(D) R85.2
NetN2_3: N2.3 P29.1(B) R11.1
NetN7_1: N7.1 P13.3(C) P16.1(B) R95.1
NetN7_2: N7.2 P16.2(E) Q10.1(G)
NetN8_1: N8.1 R74.2 R104.1
NetN8_3: N8.3 R92.2
NetN9_1: N9.1 P26.3(C) P27.1(B) R122.1
NetN9_2: N9.2 P27.2(E) Q11.1(G)
NetN10_1: N10.1 R89.2 R123.1
NetN10_3: N10.3 R111.2
NetP13_1: P13.1(B) R82.2 R92.1
NetP26_1: P26.1(B) R109.2 R111.1
NetP28_2: P28.2(E) R13.1 R33.2
NetP29_2: P29.2(E) Q2.1(G) R10.1 R11.2 R75.2
NetQ2_2: Q2.2(D) U12.1 U21.1
NetQ10_3: Q10.3(S) R77.2 R79.2
NetQ11_3: Q11.3(S) R79.1 R84.2
NetR58_1: R58.1 R59.2 R62.1 U7.3(VINA+)
NetR59_1: R59.1 R76.1 U7.6(VINB-) U7.7(VOUTB)
NetR67_1: R67.1 R68.1 U8.5(IN_B+)
NetR70_1: R70.1 R71.2 R72.1 U7.2(VINA-)
NetR76_2: R76.2 R77.1 U9.3(+INA)
NetR80_1: R80.1 U8.3(IN_A+)
NetR86_1: R86.1 R87.1 U9.4(-INA)

### Notes on the sheet
- Down-programmer
- OUT:0-35V（MAX：40V）
- 稳定低阻的 50mV 小基准电压
- (near R55) 50mV
- 低电平使能
- Voltage control loop
- 接线端子正
- (near R59) 50mV
- (near U7) （0~2.5V）
- DP_EN
- 低
- U_SERVO
- 高
- DP_out
- 接线端子负
- Current control loop
- 不工作时：DP_EN输出为高，输出端拉低，保护端
- 工作时：DP_EN输出为低，输出端拉高
- (near R71) GM:1/16.5
- (near R73) CV/CC_Contral
- FB引脚保护
- （0~2.5V）
- (near R86) GM:50

### Library data of the parts
C39-C43 C56-C58 C62 C73-C75 C77-C82 C84 C85 C127-C130 C133 C134 = C0603: Capacitor; Value: 104; Published: 8-Jun-2000; LatestRevisionDate: 17-Jul-2002; LatestRevisionNote: Re-released for DXP Platform.; Publisher: Altium Limited
D11 D13 D18 = 1N4148WT: as D5 on sheet SMPS_POWER; LCSC Part Name: 100V 150mA; SupplierPart: C7420320; ManufacturerPart: 1N4148WT; Supplier Footprint: SOD-523; JLCPCB Part Class: Extended Part; Datasheet: https://item.szlcsc.com/datasheet/1N4148WT/8397142.html; Supplier: LCSC; ConvertToPcb: yes; FootprintName: SOD-523_L1.2-W0.8-LS1.6-FD; Voltage - Forward(Vf@If): 1.25V@150mA
Q2 Q10 Q11 = 50n04: 数量:1个N沟道;漏源电压(Vdss):40V;连续漏极电流(Id):45A;导通电阻(RDS(on)):11mΩ;耗散功率(Pd):20W;阈值电压(Vgs(th)):2V;; Manufacturer: HL(富海微); AddInBom: yes; ModelId: ce57f84d66384067af8a68020b6de06d; ModelName: TO-252-2L-3P_L6.6-W6.1-H2.3-LS10.1-P4.6; ModelTransform: 259.842,390.52442,0,90,0,0,-39.39,0,0; Number: 1个N沟道; Drain to Source Voltage: 40V; Current - Continuous Drain(Id): 45A; RDS(on): 11mΩ; Pd - Power Dissipation: 20W; Gate Threshold Voltage (Vgs(th)): 2V; Gate Charge(Qg): 22.9nC@10V; Type: N沟道; Symbol: 50N04; LCSC Part Name: 1个N沟道 耐压:40V 电流:45A; SupplierPart: C7543827; ManufacturerPart: 50N04; Supplier Footprint: TO-252; JLCPCB Part Class: Extended Part; Datasheet: https://item.szlcsc.com/datasheet/50N04/8649544.html; Supplier: LCSC; ConvertToPcb: yes; FootprintName: TO-252-2_L6.6-W6.1-P4.57-LS9.9-BR-CW; Operating Temperature: -55℃~+150℃
Q4 = 2n7002_c7420321: 数量:1个N沟道;漏源电压(Vdss):60V;连续漏极电流(Id):115mA;导通电阻(RDS(on)):900mΩ@10V;耗散功率(Pd):225mW;阈值电压(Vgs(th)):1.6V;; Manufacturer: R+O(宏嘉诚); AddInBom: yes; ModelId: c62791f0466c4ae2a892c056b845b0ca; ModelName: SOT-23-3P_L2.9-W1.3-H1.0-LS2.4-P0.95; ModelTransform: 98.425,114.173,0,180,0,0,0.0005,-0.0005,0; Number: 1个N沟道; Drain to Source Voltage: 60V; Current - Continuous Drain(Id): 115mA; Pd - Power Dissipation: 225mW; Gate Threshold Voltage (Vgs(th)): 1.6V; Gate Charge(Qg): 1.6nC@10V; Input Capacitance(Ciss): 50pF; Reverse Transfer Capacitance (Crss@Vds): 5pF; Type: N沟道; Output Capacitance(Coss): 25pF; Symbol: 2N7002_C7420321; LCSC Part Name: N沟道,电流:115mA,耐压:60V; SupplierPart: C7420321; ManufacturerPart: 2N7002; Supplier Footprint: SOT-23; JLCPCB Part Class: Extended Part; Datasheet: https://item.szlcsc.com/datasheet/2N7002/8397143.html; Supplier: LCSC; ConvertToPcb: yes; FootprintName: SOT-23-3_L2.9-W1.3-P1.90-LS2.4-BR; RDS(on): 900mΩ@10V; Operating Temperature: -55℃~+150℃
R10 R11 R13 R33 R75 R83 R85 R91 = 0603-1KΩ-5%: as R12 on sheet SMPS_POWER
R36 R48 R52 R55 R58 R59 R61-R65 R67-R74 R76-R78 R80-R82 R86 R87 R89 R92 R95 R104 R109 R111 R122 R123 = R0603: Resistor; Published: 8-Jun-2000; LatestRevisionDate: 17-Jul-2002; LatestRevisionNote: Re-released for DXP Platform.; Publisher: Altium Limited
R79 R84 = hollr2512-3w-2mr-1%: as R29 on sheet SMPS_POWER; Symbol: HOLLR2512-3W-2MR-1%; LCSC Part Name: 2mΩ ±1% 3W; SupplierPart: C2994640; ManufacturerPart: HoLLR2512-3W-2mR-1%; Supplier Footprint: 2512; JLCPCB Part Class: Extended Part; Datasheet: https://atta.szlcsc.com/upload/public/pdf/source/20220330/9E8D3880B1628B3B70C68092C8A7E08B.pdf; Supplier: LCSC; ConvertToPcb: yes; FootprintName: RES-SMD_L6.4-W3.2-1; ModelName: RES-SMD_L6.4-W3.2-1; Type: 采样电阻; Rated Output Voltage: -; Temperature Coefficient: ±50ppm/℃
U7 = opa2192idr: 放大器数:双路;增益带宽积(GBP):10MHz;输入偏置电流(Ib):5pA;输入失调电压(Vos):-;压摆率(SR):20V/us;轨到轨:轨到轨输入,轨到轨输出;; Manufacturer: TI(德州仪器); AddInBom: yes; ModelId: e81d2f7d937b4a6ab1dca543ff5d56a4; ModelName: SOIC-8_L4.9-W3.9-H1.7-LS6.0-P1.27; ModelTransform: 192.913,236.22,0,0,0,0,0,0,0; Number of Channels: 双路; Gain Bandwidth Product: 10MHz; Ib - Input Bias Current: 5pA; Slew Rate: 20V/us; Output Current: 65mA; Quiescent Current(Iq): 1mA; Symbol: OPA2192IDR; LCSC Part Name: OPA2192IDR; SupplierPart: C110074; ManufacturerPart: OPA2192IDR; Supplier Footprint: SOIC-8; JLCPCB Part Class: Extended Part; Datasheet: https://www.ti.com/cn/lit/gpn/opa2192; Supplier: LCSC; ConvertToPcb: yes; FootprintName: SOIC-8_L4.9-W3.9-P1.27-LS6.0-BL; Vos - Input Offset Voltage: -; Common Mode Rejection Ratio(CMRR): -; Rail to Rail: 轨到轨输入,轨到轨输出; Operating Temperature: -40℃~+125℃
U8 = opa2376aidr_1: 放大器数:双路;增益带宽积(GBP):5.5MHz;输入偏置电流(Ib):0.2pA;压摆率(SR):2V/us;轨到轨:-;; Manufacturer: TI(德州仪器); AddInBom: yes; ModelId: e81d2f7d937b4a6ab1dca543ff5d56a4; ModelName: SOIC-8_L4.9-W3.9-H1.7-LS6.0-P1.27; ModelTransform: 192.913,236.22,0,0,0,0,0,0,0; Number of Circuits: 双路; Gain Bandwidth Product(GBP): 5.5MHz; Current - Input Bias(Ib): 0.2pA; Slew Rate(SR): 2V/us; Output Current: 50mA; Supply Current: 760uA; Symbol: OPA2376AID; LCSC Part Name: OPA2376AIDR; SupplierPart: C46316; ManufacturerPart: OPA2376AIDR; Supplier Footprint: SOIC-8; JLCPCB Part Class: Extended Part; Datasheet: https://www.ti.com/cn/lit/gpn/opa376; Supplier: LCSC; ConvertToPcb: yes; FootprintName: SOIC-8_L4.9-W3.9-P1.27-LS6.0-BL; Output Type: -; Rail to Rail: -; Operating Temperature: -40℃~+125℃
U9 = opa388qdbvrq1: 放大器数:单路;增益带宽积(GBP):10MHz;输入偏置电流(Ib):30pA;输入失调电压(Vos):250nV;压摆率(SR):5V/us;轨到轨:轨到轨输入,轨到轨输出;; Manufacturer: TI(德州仪器); AddInBom: yes; ModelId: 0a2a1b8f50944f73965918ad6e5fe167; ModelName: SOT-23-5_L2.9-W1.6-H1.1-LS2.8-P0.95; ModelTransform: 114.173,109.636,0,180,0,0,0,0,0; Number of Channels: 单路; Gain Bandwidth Product: 10MHz; Ib - Input Bias Current: 30pA; Vos - Input Offset Voltage: 250nV; Common Mode Rejection Ratio(CMRR): 140dB; Slew Rate: 5V/us; Output Current: 60mA; Input Offset Voltage Drift(Vos TC): 5nV/℃; Quiescent Current(Iq): 1.9mA; Single Supply: 2.5V~5.5V; Dual Supply: 1.25V~2.75V；-2.75V~-1.25V; Maximum Power Supply Range (Vdd-Vss): 5.5V; Noise density(eN): 7nV/√Hz@1kHz; Input Offset Current(Ios): 700pA; Symbol: OPA388QDBVRQ1; LCSC Part Name: 自动、精密、零漂移、零交叉、真正的轨至轨输入/输出运算放大器; SupplierPart: C2871496; ManufacturerPart: OPA388QDBVRQ1; Supplier Footprint: SOT-23-5; JLCPCB Part Class: Extended Part; Datasheet: https://www.ti.com/cn/lit/gpn/opa388-q1; Supplier: LCSC; ConvertToPcb: yes; FootprintName: SOT-23-5_L3.0-W1.7-P0.95-LS2.8-BR; Rail to Rail: 轨到轨输入,轨到轨输出; Features: EMI滤波/RF抑制；零漂移/自动稳零；过压保护; Operating Temperature: -40℃~+125℃
U12 U21 = mof5ws-100Ω±5%t: 电阻类型:金属氧化膜电阻;阻值:100Ω;精度:±5%;功率:5W;温度系数:±700ppm/℃;; Manufacturer: 华星机电; AddInBom: yes; ModelId: a7638b0f76d54b0db5a676fc97b6c5ec; ModelTransform: 873.2266,236.22,0,0,0,0,-0.005,0,-196.85; Value: 100Ω; Tolerance: ±5%; Power(Watts): 5W; Symbol: MOF5WS-100Ω±5%T; LCSC Part Name: 金属氧化膜电阻 100Ω ±5% 5W; SupplierPart: C714488; ManufacturerPart: MOF5WS-100Ω±5%T; Supplier Footprint: 插件,D6xL17.5mm; JLCPCB Part Class: Extended Part; Datasheet: https://item.szlcsc.com/datasheet/MOF5WS-100%25CE%25A9%25C2%25B15%2525T/754813.html; Supplier: LCSC; ConvertToPcb: yes; FootprintName: RES-TH_BD6.0-L17.5-P21.50-D0.7; ModelName: RES-TH_BD6.0-L17.5-P21.50-D0.7; Type: 金属氧化膜电阻; Temperature Coefficient: ±700ppm/℃
N2 N7-N10 = MMTB3904: Part Number: *; Brand: *
P13 P16 P26-P29 = MMBT3906: Part Number: *; Brand: *

## Sheet CC_CV_Indicators_and_sense_error.SchDoc
size A4; SheetNumber: 5; SheetTotal: 7
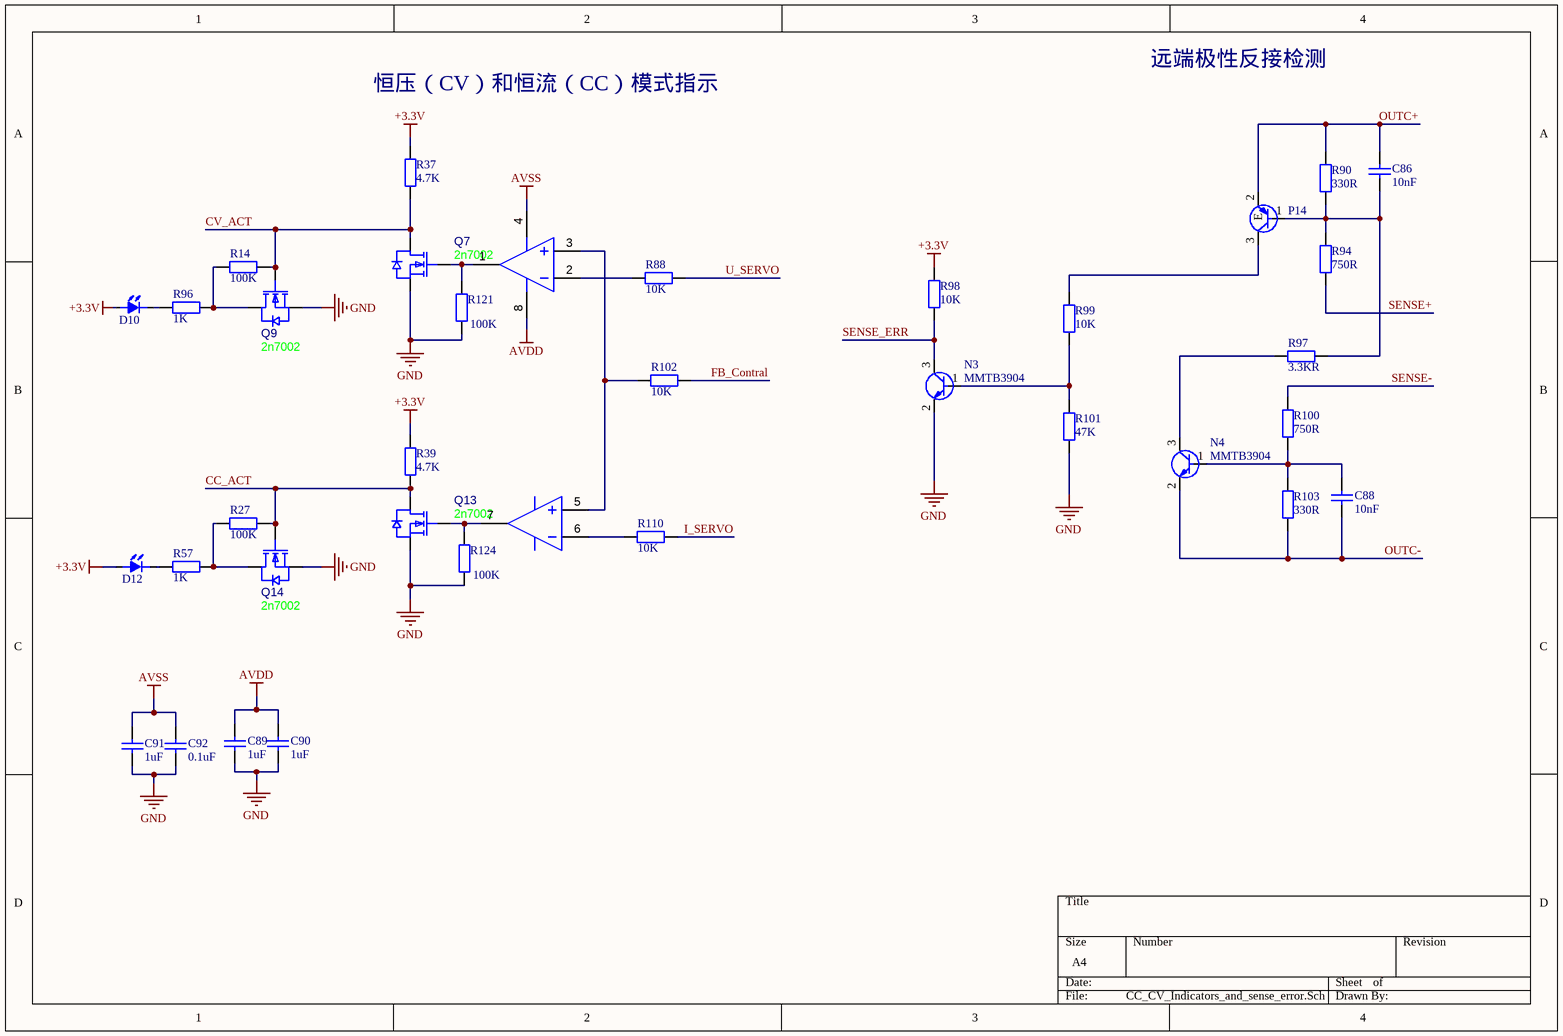
[diagram p4: CC_CV_Indicators_and_sense_error.SchDoc]

### Parts
C86  10nF  [C0603]
C88  10nF  [C0603]
C89  1uF  [C0603]
C90  1uF  [C0603]
C91  1uF  [C0603]
C92  0.1uF  [C0603]
D10  DIO_LED  [LED0603-RD_RED]  (value not drawn)
D12  DIO_LED  [LED0603-RD_RED]  (value not drawn)
N3  MMTB3904  [SOT-23-3_L2.9-W1.3-P1.90-LS2.4-BR - duplicate]
N4  MMTB3904  [SOT-23-3_L2.9-W1.3-P1.90-LS2.4-BR - duplicate]
P14  MMBT3906  [SOT-23-3_L2.9-W1.3-P1.90-LS2.4-BR]  (value not drawn)
Q7  2n7002  [SOT-23-3_L2.9-W1.3-P1.90-LS2.4-BR]
Q9  2n7002  [SOT-23-3_L2.9-W1.3-P1.90-LS2.4-BR]
Q13  2n7002  [SOT-23-3_L2.9-W1.3-P1.90-LS2.4-BR]
Q14  2n7002  [SOT-23-3_L2.9-W1.3-P1.90-LS2.4-BR]
R14  100K  [R0603]
R27  100K  [R0603]
R37  4.7K  [R0603]
R39  4.7K  [R0603]
R57  1K  [R0603]
R88  10K  [R0603]
R90  330R  [R0603]
R94  750R  [R0603]
R96  1K  [R0603]
R97  3.3KR  [R0603]
R98  10K  [R0603]
R99  10K  [R0603]
R100  750R  [R0603]
R101  47K  [R0603]
R102  10K  [R0603]
R103  330R  [R0603]
R110  10K  [R0603]
R121  100K  [R0603]
R124  100K  [R0603]
U10  lm293d  [SO-8_L4.9-W3.9-P1.27-LS6.0-BL]  (value not drawn)  (parts A,B of 2)

### Nets
+3.3V: D10.2 D12.2 R37.1 R39.1 R98.2
AVDD: C89.2 C90.2 U10.8(VCC+)
AVSS: C91.2 C92.2 U10.4(VCC-)
GND: C89.1 C90.1 C91.1 C92.1 N3.2 Q7.2(S) Q9.2(S) Q13.2(S) Q14.2(S) R101.1 R121.2 R124.2
SENSE+: R94.1
SENSE-: R100.1
CC_ACT: Q13.3(D) Q14.1(G) R27.2 R39.2
CV_ACT: Q7.3(D) Q9.1(G) R14.2 R37.2
FB_Contral: R102.1
I_SERVO: R110.1
OUTC+: C86.2 P14.2(E) R90.2
OUTC-: C88.1 N4.2 R103.2
SENSE_ERR: N3.3 R98.1
U_SERVO: R88.1
NetC86_1: C86.1 P14.1(B) R90.1 R94.2 R97.1
NetC88_2: C88.2 N4.1 R100.2 R103.1
NetD10_1: D10.1 R96.1
NetD12_1: D12.1 R57.1
NetN3_1: N3.1 R99.1 R101.2
NetN4_3: N4.3 R97.2
NetP14_3: P14.3(C) R99.2
NetQ7_1: Q7.1(G) R121.1 U10.1(OUT1)
NetQ9_3: Q9.3(D) R14.1 R96.2
NetQ13_1: Q13.1(G) R124.1 U10.7(OUT2)
NetQ14_3: Q14.3(D) R27.1 R57.2
NetR88_2: R88.2 U10.2(IN1-)
NetR102_2: R102.2 U10.3(IN1+) U10.5(IN2+)
NetR110_2: R110.2 U10.6(IN2-)

### Notes on the sheet
- 恒压（CV）和恒流（CC）模式指示
- 远端极性反接检测

### Library data of the parts
C86 C88-C92 = C0603: Capacitor; Value: 104; Published: 8-Jun-2000; LatestRevisionDate: 17-Jul-2002; LatestRevisionNote: Re-released for DXP Platform.; Publisher: Altium Limited
D10 D12 = DIO_LED: Brand: LED; Part Number: *
Q7 Q9 Q13 Q14 = 2n7002_c7420321: as Q4 on sheet CC_CV_Down-programmer; Symbol: 2N7002_C7420321; LCSC Part Name: N沟道,电流:115mA,耐压:60V; SupplierPart: C7420321; ManufacturerPart: 2N7002; Supplier Footprint: SOT-23; JLCPCB Part Class: Extended Part; Datasheet: https://item.szlcsc.com/datasheet/2N7002/8397143.html; Supplier: LCSC; ConvertToPcb: yes; FootprintName: SOT-23-3_L2.9-W1.3-P1.90-LS2.4-BR; RDS(on): 900mΩ@10V; Operating Temperature: -55℃~+150℃
R14 R27 R37 R39 R57 R88 R90 R94 R96-R103 R110 R121 R124 = R0603: Resistor; Published: 8-Jun-2000; LatestRevisionDate: 17-Jul-2002; LatestRevisionNote: Re-released for DXP Platform.; Publisher: Altium Limited
U10 = lm293d: 比较器数:双路;输入失调电压(Vos):1mV;输入偏置电流(Ib):20nA;; Manufacturer: ST(意法半导体); Symbol: LM293D_C283313; AddInBom: yes; ModelId: 50ce3402a2354e6c8e8bd1c9ad02453e; ModelTransform: 192.913,236.22,0,0,0,0,0,0,0; Number of Channels: 双路; Vos - Input Offset Voltage: 1mV; Ib - Input Bias Current: 20nA; Propagation Delay Time: 1.3us; Output Mode: MOS；CMOS；ECL；DTL；TTL; Quiescent Current: 450uA; Maximum Power Supply Range (Vdd-Vss): 36V; Single Supply: 2V~36V; Dual Supply: 1V~18V；-18V~-1V; Input Offset Current(Ios): 3nA; LCSC Part Name: 低功耗双电压比较器; SupplierPart: C283313; ManufacturerPart: LM293D; Supplier Footprint: SO-8; JLCPCB Part Class: Extended Part; Datasheet: https://item.szlcsc.com/datasheet/LM293D/269222.html; Supplier: LCSC; ConvertToPcb: yes; FootprintName: SO-8_L4.9-W3.9-P1.27-LS6.0-BL; ModelName: SO-8_L4.9-W3.9-P1.27-LS6.0-BL; Common Mode Rejection Ratio(CMRR): -; Output Type: -; Operating Temperature: -40℃~+105℃; Response Time (tr): 1.3us; Features: -
N3 N4 = MMTB3904: Part Number: *; Brand: *
P14 = MMBT3906: Part Number: *; Brand: *

## Sheet DAC、ADC、IO_Espander.SchDoc
size A4; SheetNumber: 6; SheetTotal: 7
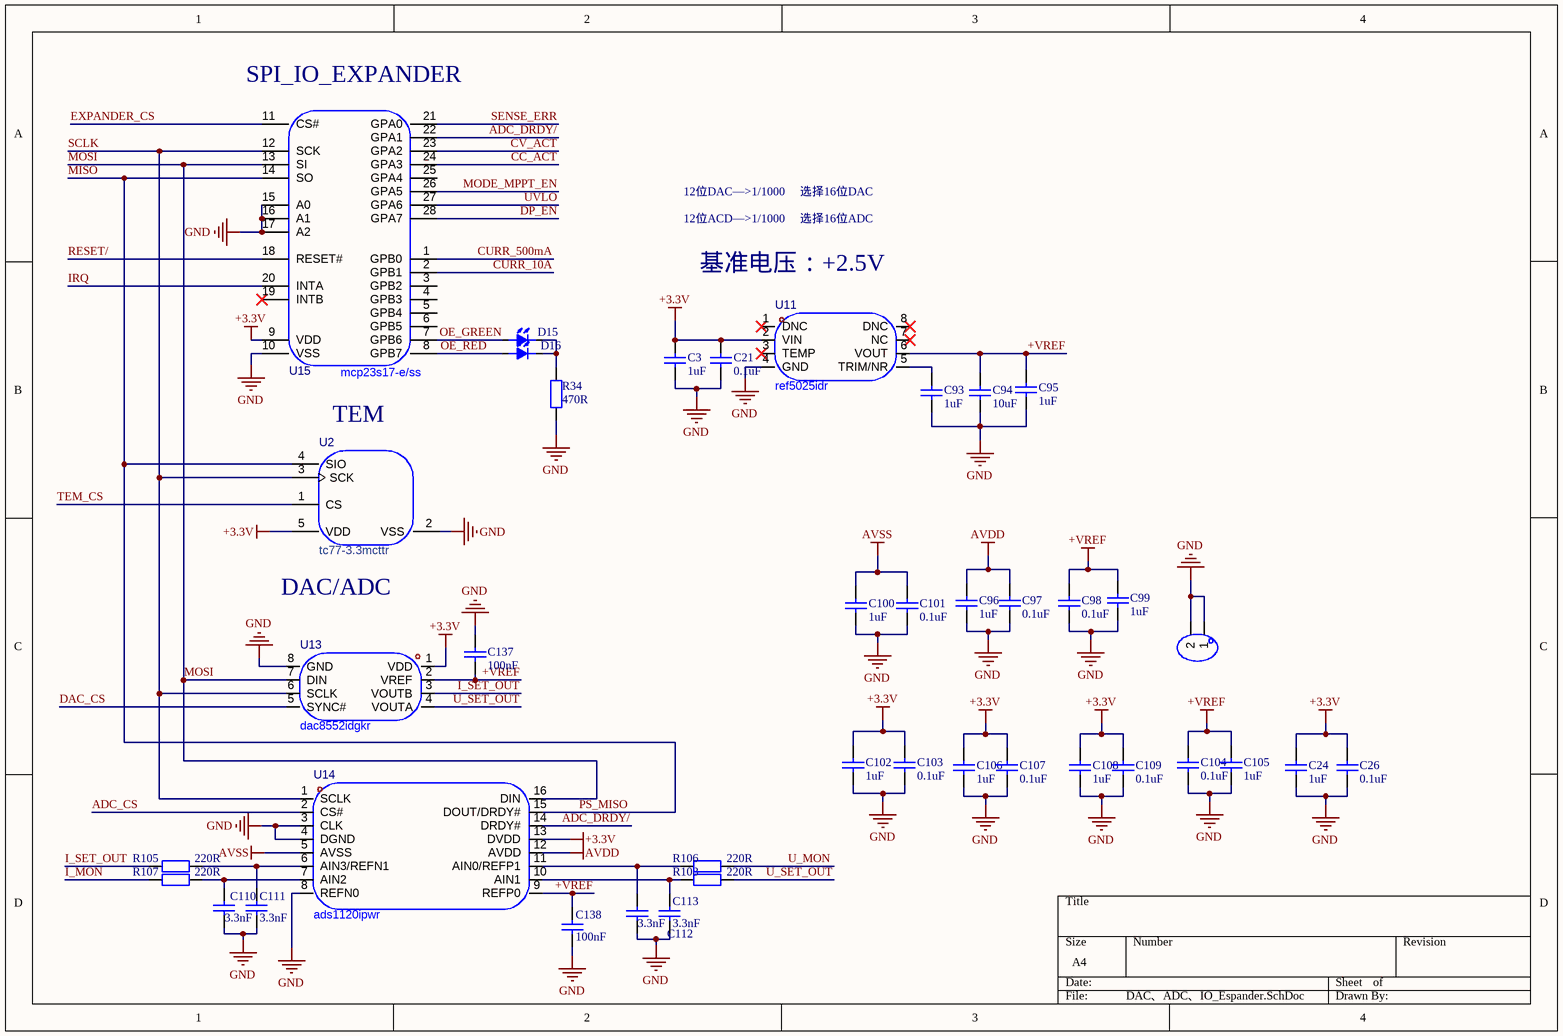
[diagram p5: DAC、ADC、IO_Espander.SchDoc]

### Parts
C3  1uF  [C0603]
C21  0.1uF  [C0603]
C24  1uF  [C0603]
C26  0.1uF  [C0603]
C93  1uF  [C0603]
C94  10uF  [C0603]
C95  1uF  [C0603]
C96  1uF  [C0603]
C97  0.1uF  [C0603]
C98  0.1uF  [C0603]
C99  1uF  [C0603]
C100  1uF  [C0603]
C101  0.1uF  [C0603]
C102  1uF  [C0603]
C103  0.1uF  [C0603]
C104  0.1uF  [C0603]
C105  1uF  [C0603]
C106  1uF  [C0603]
C107  0.1uF  [C0603]
C108  1uF  [C0603]
C109  0.1uF  [C0603]
C110  3.3nF  [C0603]
C111  3.3nF  [C0603]
C112  3.3nF  [C0603]
C113  3.3nF  [C0603]
C137  100nF  [C0603]
C138  100nF  [C0603]
D15  DIO_LED  [LED0603-RD_RED]  (value not drawn)
D16  DIO_LED  [LED0603-RD_RED]  (value not drawn)
H6  pz254v-11-02p  [HDR-TH_2P-P2.54-V-M]  (value not drawn)
R34  470R  [R0603]
R105  220R  [R0603]
R106  220R  [R0603]
R107  220R  [R0603]
R108  220R  [R0603]
U2  tc77-3.3mcttr  [SOT-23-5_L3.0-W1.7-P0.95-LS2.8-BL]
U11  ref5025idr  [SOIC-8_L4.9-W3.9-P1.27-LS6.0-BL]
U13  dac8552idgkr  [VSSOP-8_L3.0-W3.0-P0.65-LS5.0-BL]
U14  ads1120ipwr  [TSSOP-16_L5.0-W4.4-P0.65-LS6.4-BL]
U15  mcp23s17-e/ss  [SSOP-28_L10.2-W5.3-P0.65-LS7.8-BL]

### Nets
+3.3V: C3.2 C21.2 C24.2 C26.2 C102.2 C103.2 C106.2 C107.2 C108.2 C109.2 U2.5(VDD) U11.2(VIN) U13.1(VDD) U14.13(DVDD) U15.9(VDD)
+VREF: C94.2 C95.2 C98.2 C99.2 C104.2 C105.2 C137.2 C138.2 U11.6(VOUT) U13.2(VREF) U14.9(REFP0)
AVDD: C96.2 C97.2 U14.12(AVDD)
AVSS: C100.2 C101.2 U14.5(AVSS)
GND: C3.1 C21.1 C24.1 C26.1 C93.1 C94.1 C95.1 C96.1 C97.1 C98.1 C99.1 C100.1 C101.1 C102.1 C103.1 C104.1 C105.1 C106.1 C107.1 C108.1 C109.1 C110.1 C111.1 C112.1 C113.1 C137.1 C138.1 H6.1 H6.2 R34.2 U2.2(VSS) U11.4(GND) U13.8(GND) U14.3(CLK) U14.4(DGND) U14.8(REFN0) U15.10(VSS) U15.15(A0) U15.16(A1) U15.17(A2)
ADC_CS: U14.2(CS#)
ADC_DRDY/: U14.14(DRDY#) U15.22(GPA1)
CC_ACT: U15.24(GPA3)
CURR_10A: U15.2(GPB1)
CURR_500mA: U15.1(GPB0)
CV_ACT: U15.23(GPA2)
DAC_CS: U13.5(SYNC#)
DP_EN: U15.28(GPA7)
EXPANDER_CS: U15.11(CS#)
I_MON: R107.1
I_SET_OUT: R105.1 U13.3(VOUTB)
IRQ: U15.20(INTA)
MISO: U2.4(SIO) U14.15(DOUT/DRDY#) U15.14(SO)  [also labelled PS_MISO]
MODE_MPPT_EN: U15.26(GPA5)
MOSI: U13.7(DIN) U14.16(DIN) U15.13(SI)
OE_GREEN: D15.2 U15.7(GPB6)
OE_RED: D16.2 U15.8(GPB7)
RESET/: U15.18(RESET#)
SCLK: U2.3(SCK) U13.6(SCLK) U14.1(SCLK) U15.12(SCK)
SENSE_ERR: U15.21(GPA0)
TEM_CS: U2.1(CS)
U_MON: R106.2
U_SET_OUT: R108.2 U13.4(VOUTA)
UVLO: U15.27(GPA6)
NetC93_2: C93.2 U11.5(TRIM/NR)
NetC110_2: C110.2 R107.2 U14.7(AIN2)
NetC111_2: C111.2 R105.2 U14.6(AIN3/REFN1)
NetC112_2: C112.2 R106.1 U14.11(AIN0/REFP1)
NetC113_2: C113.2 R108.1 U14.10(AIN1)
NetD15_1: D15.1 D16.1 R34.1

Not connected (* = marked no-connect by the designer): U11 1(DNC)* 3(TEMP)* 7(NC)* 8(DNC)*; U15 3(GPB2) 4(GPB3) 5(GPB4) 6(GPB5) 19(INTB)* 25(GPA4)

### Notes on the sheet
- (near U15) SPI_IO_EXPANDER
- 12位DAC—>1/1000     选择16位DAC
- 12位ACD—>1/1000     选择16位ADC
- 基准电压：+2.5V
- TEM
- DAC/ADC

### Library data of the parts
C3 C21 C24 C26 C93-C113 C137 C138 = C0603: Capacitor; Value: 104; Published: 8-Jun-2000; LatestRevisionDate: 17-Jul-2002; LatestRevisionNote: Re-released for DXP Platform.; Publisher: Altium Limited
D15 D16 = DIO_LED: Brand: LED; Part Number: *
H6 = pz254v-11-02p: as H7 on sheet Bias_Power_Supply; Symbol: PZ254V-11-02P; LCSC Part Name: 1x2P 间距:2.54mm 方针 直插; SupplierPart: C492401; ManufacturerPart: PZ254V-11-02P; Supplier Footprint: 插件,P=2.54mm; JLCPCB Part Class: Extended Part; Datasheet: https://item.szlcsc.com/datasheet/PZ254V-11-02P/502957.html; Supplier: LCSC; ConvertToPcb: yes; FootprintName: HDR-TH_2P-P2.54-V-M; Row Spacing: -; Mounting Type: 直插; Number of Rows: 单排; Number of Pins: 2P; Length of Mating Pin: 6mm; Insulation Height: 2.5mm; Length of End Connection Pin: 3mm; Contact Material: 黄铜; Contact Plating: -; Operating Temperature: -40℃~+105℃; Color: 黑色
R34 R105-R108 = R0603: Resistor; Published: 8-Jun-2000; LatestRevisionDate: 17-Jul-2002; LatestRevisionNote: Re-released for DXP Platform.; Publisher: Altium Limited
U2 = tc77-3.3mcttr_1: 检测温度:-55℃~+125℃;精度:±1℃;接口类型:SPI;; Manufacturer: MICROCHIP(美国微芯); AddInBom: yes; ModelId: 0a2a1b8f50944f73965918ad6e5fe167; ModelName: SOT-23-5_L2.9-W1.6-H1.1-LS2.8-P0.95; ModelTransform: 118.60433,114.173,0,90,0,0,0.0005,0.0005,0; Tolerance: ±1℃; Voltage - Supply: 2.7V~5.5V; Standby Current: 1uA; Interface: SPI; Temperature Conversion Time: 300ms; Temperature Resolution: 13bit; Symbol: TC77-3.3MCTTR; LCSC Part Name: 带SPI接口的温度传感器; SupplierPart: C56616; ManufacturerPart: TC77-3.3MCTTR; Supplier Footprint: SOT-23-5; JLCPCB Part Class: Extended Part; Datasheet: https://item.szlcsc.com/datasheet/TC77-3.3MCTTR/57645.html; Supplier: LCSC; ConvertToPcb: yes; FootprintName: SOT-23-5_L3.0-W1.7-P0.95-LS2.8-BL; Detection Temperature Range: -55℃~+125℃; Operating Temperature: -
U11 = ref5025idr: 输出类型:固定;输入电压:2.7V~18V;输出电压:2.5V;输出电流:10mA;精度:±0.05%;; Manufacturer: TI(德州仪器); AddInBom: yes; ModelId: e81d2f7d937b4a6ab1dca543ff5d56a4; ModelName: SOIC-8_L4.9-W3.9-H1.7-LS6.0-P1.27; ModelTransform: 192.913,236.22,0,0,0,0,0,0,0; Output Type: 固定; Output Voltage: 2.5V; Output Current: 10mA; Tolerance: ±0.05%; Temperature Coefficient: 3ppm/℃; Reference Type: 串联; Supply Current: 1.2mA; Noise - 1/10Hz to 10Hz: 3uVp-p; Symbol: REF5025IDR; LCSC Part Name: REF5025IDR; SupplierPart: C544535; ManufacturerPart: REF5025IDR; Supplier Footprint: SOIC-8; JLCPCB Part Class: Extended Part; Datasheet: https://www.ti.com/cn/lit/gpn/ref5030; Supplier: LCSC; ConvertToPcb: yes; FootprintName: SOIC-8_L4.9-W3.9-P1.27-LS6.0-BL; Input Voltage: 2.7V~18V; Noise - 10Hz to 10kHz: -; Operating Temperature: -40℃~+125℃@(Ta)
U13 = dac8552idgkr: 分辨率(位):16位;接口类型:SPI;工作电压:2.7V~5.5V;稳定时间:10us;积分非线性:4LSB;; Manufacturer: TI(德州仪器); AddInBom: yes; ModelId: fe8ada2663e64b00b932016623def703; ModelName: VSSOP-8_L3.0-W3.0-H1.1-LS4.9-P0.65; ModelTransform: 197.34433,118.11,0,90,0,0,0,0.0005,0; Resolution(Bits): 16位; Number of Channels: 2; Interface: SPI; Settling Time: 10us; Output Type: 电压-缓冲; Integral non - linearity: 4LSB; Power-On Reset: 内置; Voltage Reference: 外置; Quiescent Current (Iq): 700nA; Symbol: DAC8552IDGKR; LCSC Part Name: 16位、双通道、电压输出数模转换器; SupplierPart: C136020; ManufacturerPart: DAC8552IDGKR; Supplier Footprint: MSOP-8; JLCPCB Part Class: Extended Part; Datasheet: https://www.ti.com/cn/lit/gpn/dac8552; Supplier: LCSC; ConvertToPcb: yes; FootprintName: VSSOP-8_L3.0-W3.0-P0.65-LS5.0-BL; Voltage - Supply: 2.7V~5.5V; Operating Temperature: -40℃~+105℃; Sampling Rate: -; Voltage Reference Drift: -; Data rate: -
U14 = ads1120ipwr: 分辨率(位):16;采样率:2kHz;工作电压:2.3V~5.5V;接口类型:SPI;; Manufacturer: TI(德州仪器); AddInBom: yes; ModelId: e184b9ae7def452b81228c95a013214c; ModelName: TSSOP-16_L5.0-W4.4-H1.0-LS6.4-P0.65; ModelTransform: 252.188,196.85,0,90,0,0,0,0.005,0; Resolution (Bits): 16; Sampling Rate: 2kHz; number of channels: 4; Interface: SPI; differential input: 是; Clock/Oscillator: 内置; Clock Frequency: 500kHz~4.5MHz；4.096MHz; Voltage Reference Drift: 5ppm/℃; Programmable Gain: 支持; ADC architecture: Sigma-Delta; Data rate: 660Hz；350Hz；2kHz；1.2kHz；180Hz；90Hz; Quiescent Current (Iq): 120uA; Symbol: ADS1120IPWR; LCSC Part Name: 4通道、2kSPS、低功耗、16位ADC，具有集成PGA和基准; SupplierPart: C84284; ManufacturerPart: ADS1120IPWR; Supplier Footprint: TSSOP-16; JLCPCB Part Class: Extended Part; Datasheet: https://www.ti.com/cn/lit/gpn/ads1120; Supplier: LCSC; ConvertToPcb: yes; FootprintName: TSSOP-16_L5.0-W4.4-P0.65-LS6.4-BL; Voltage - Supply: 2.3V~5.5V; Integral non - linearity: -; Operating Temperature: -40℃~+125℃; Signal-to-Noise Ratio: -; Voltage Reference: 内置; Temperature Sensors: 内置; Full-Scale Range(FSR): -
U15 = mcp23s17-e/ss: 接口类型:SPI;I/O数量:16;时钟频率(fc):10MHz;; Manufacturer: MICROCHIP(美国微芯); AddInBom: yes; ModelId: 0c45916be1b748f191431a304285089a; ModelName: SSOP-28_L10.2-W5.3-H2.0-LS7.8-P0.65; ModelTransform: 401.574,307.086,0,0,0,0,0,0,0; Interface: SPI; Number of I/O: 16; Interrupt Output: 有中断输出; Current - Output Low(IOL): 8mA; Current - Output High(IOH): 3mA; Clock Frequency: 10MHz; Number of Supporting Devices: 8; Quiescent Supply Current: 1uA; Output Logic Level - Low: 600mV; Voltage - Supply: 1.8V~5.5V; Symbol: MCP23S17-E/SS; LCSC Part Name: 带有串行接口的16位I/O扩展器; SupplierPart: C148009; ManufacturerPart: MCP23S17-E/SS; Supplier Footprint: SSOP-28-208mil; JLCPCB Part Class: Extended Part; Datasheet: https://item.szlcsc.com/datasheet/MCP23S17-E%252FSS/159342.html; Supplier: LCSC; ConvertToPcb: yes; FootprintName: SSOP-28_L10.2-W5.3-P0.65-LS7.8-BL; Output Type: -; Output Logic Level - High: -; Features: 复位功能；级联与地址扩展; Operating Temperature: -40℃~+125℃